# EAGLE design KRC_FOC_v2_6 (EAGLE 9.7.0)
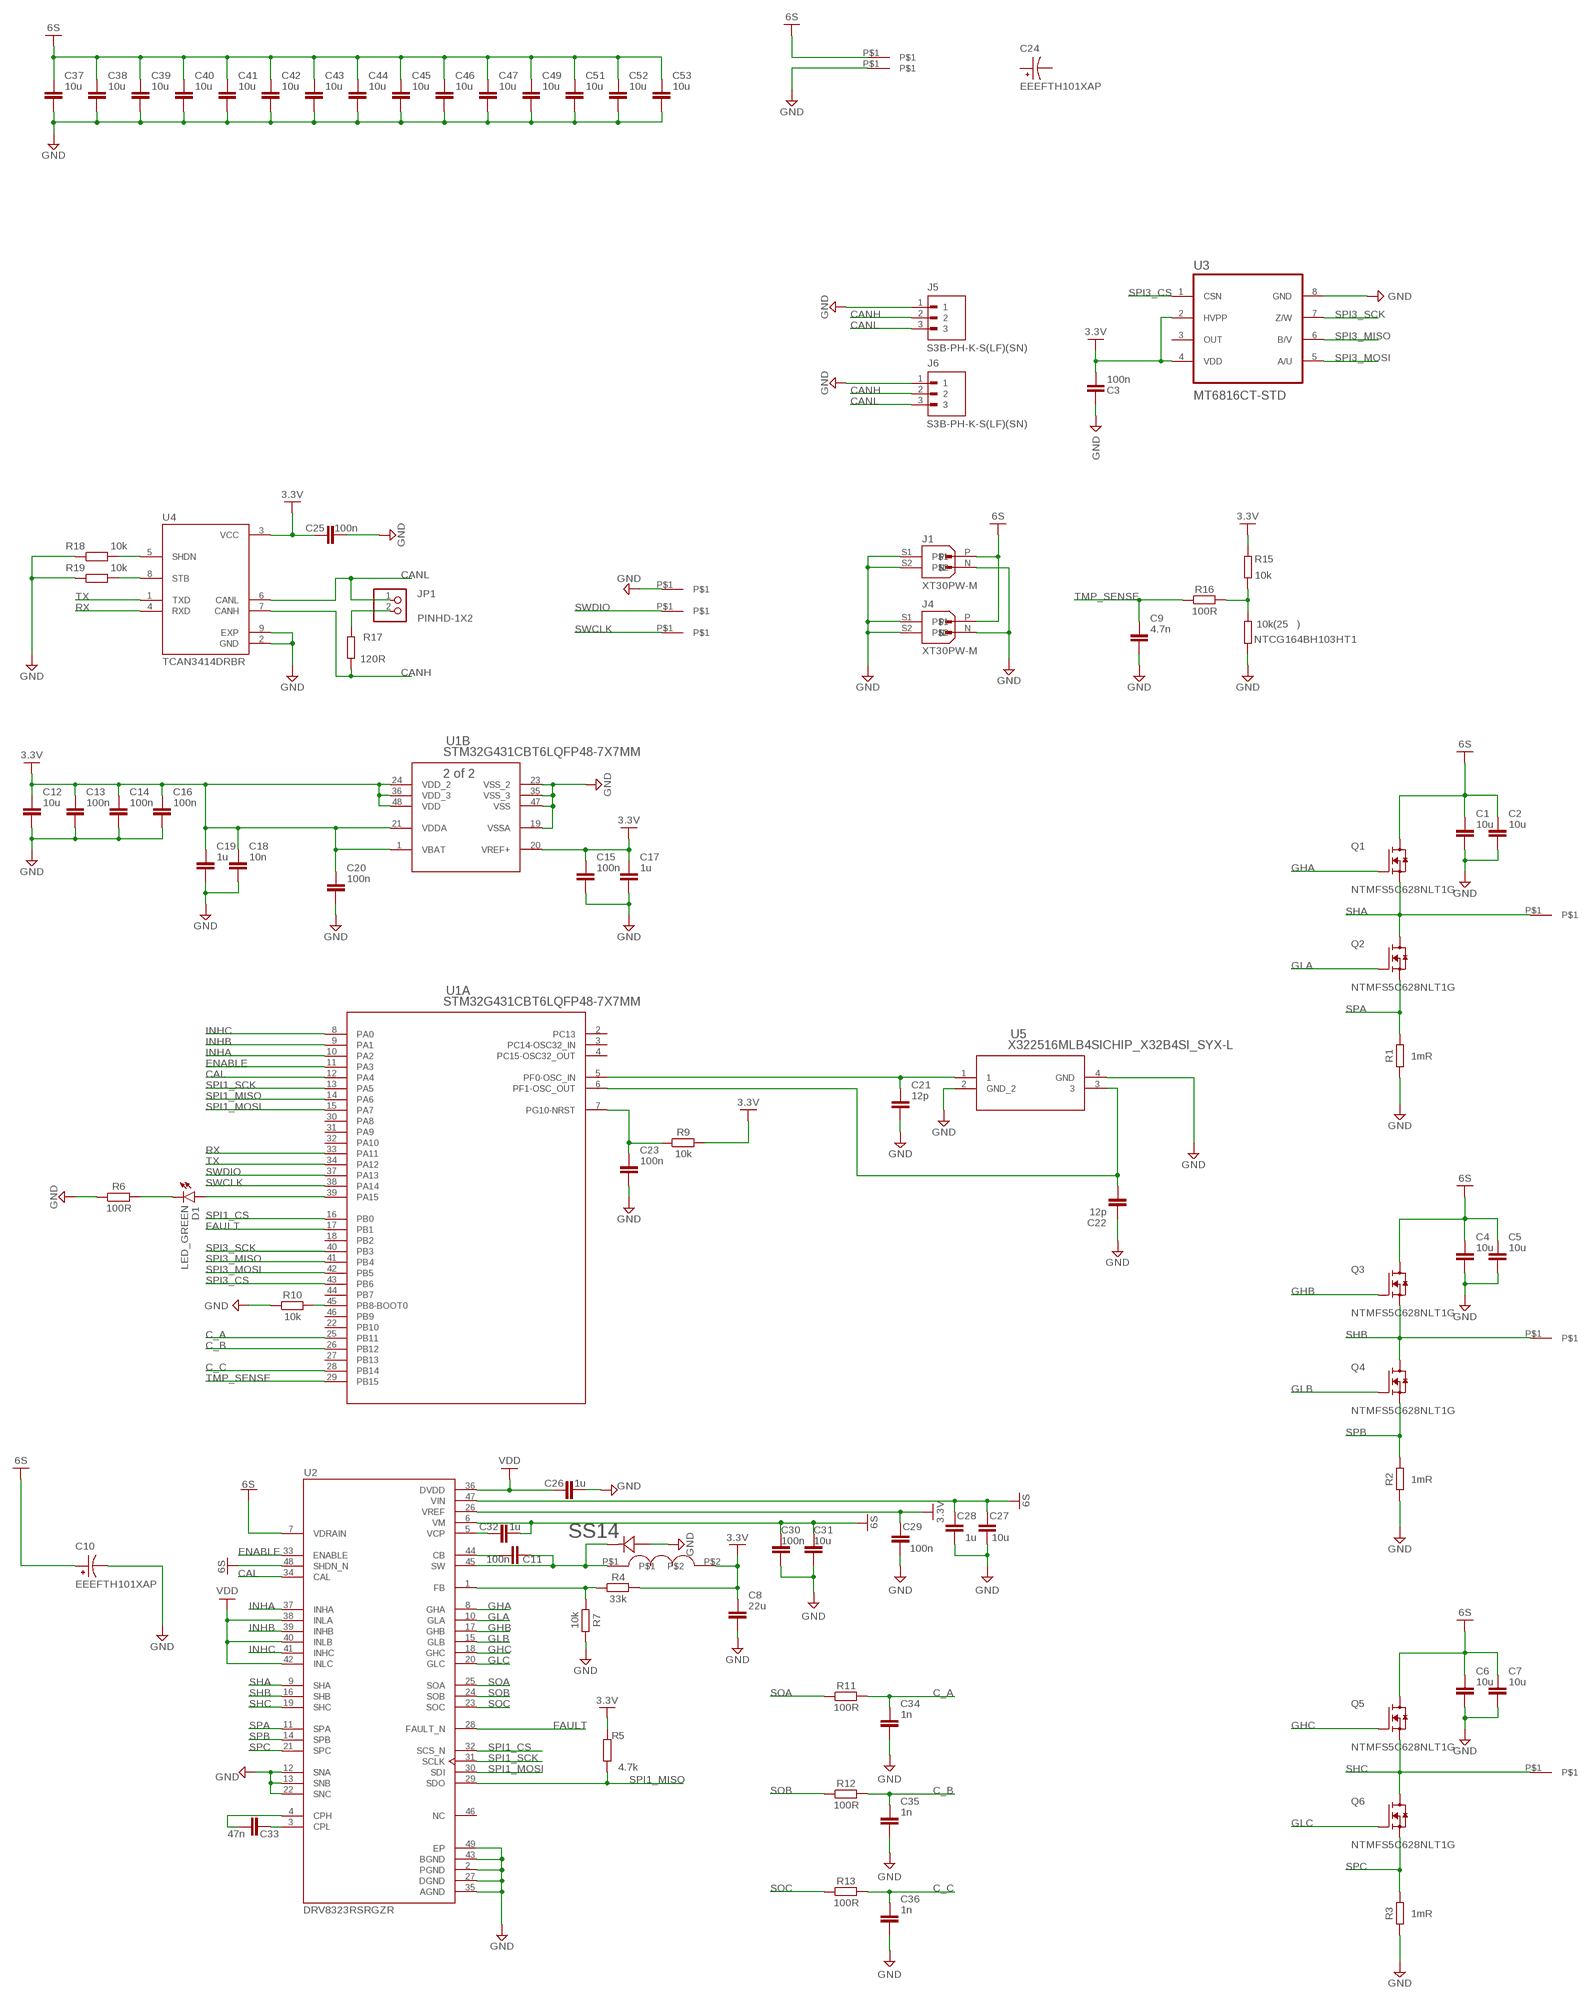
[diagram p0: schematic, sheet 1]

## Parts
C1  10u  C_CHIP-1206(3216-METRIC)  [CAPC3216X135]
C2  10u  C_CHIP-1206(3216-METRIC)  [CAPC3216X135]
C3  100n  C_CHIP-0402(1005-METRIC)  [CAPC1005X60]
C4  10u  C_CHIP-1206(3216-METRIC)  [CAPC3216X135]
C5  10u  C_CHIP-1206(3216-METRIC)  [CAPC3216X135]
C6  10u  C_CHIP-1206(3216-METRIC)  [CAPC3216X135]
C7  10u  C_CHIP-1206(3216-METRIC)  [CAPC3216X135]
C8  22u  C_CHIP-0805(2012-METRIC)  [CAPC2012X110]
C9  4.7n  C_CHIP-0402(1005-METRIC)  [CAPC1005X60]
C10  EEEFTH101XAP  [CAP_EEEFTH101XAP]
C11  100n  C_CHIP-0603(1608-METRIC)  [CAPC1608X85]
C12  10u  C_CHIP-1206(3216-METRIC)  [CAPC3216X135]
C13  100n  C_CHIP-0402(1005-METRIC)  [CAPC1005X60]
C14  100n  C_CHIP-0402(1005-METRIC)  [CAPC1005X60]
C15  100n  C_CHIP-0402(1005-METRIC)  [CAPC1005X60]
C16  100n  C_CHIP-0402(1005-METRIC)  [CAPC1005X60]
C17  1u  C_CHIP-0402(1005-METRIC)  [CAPC1005X60]
C18  10n  C_CHIP-0402(1005-METRIC)  [CAPC1005X60]
C19  1u  C_CHIP-0402(1005-METRIC)  [CAPC1005X60]
C20  100n  C_CHIP-0402(1005-METRIC)  [CAPC1005X60]
C21  12p  C_CHIP-0402(1005-METRIC)  [CAPC1005X60]
C22  12p  C_CHIP-0402(1005-METRIC)  [CAPC1005X60]
C23  100n  C_CHIP-0402(1005-METRIC)  [CAPC1005X60]
C24  EEEFTH101XAP  [CAP_EEEFTH101XAP]
C25  100n  C_CHIP-0402(1005-METRIC)  [CAPC1005X60]
C26  1u  C_CHIP-0402(1005-METRIC)  [CAPC1005X60]
C27  10u  C_CHIP-1206(3216-METRIC)  [CAPC3216X135]
C28  1u  C_CHIP-0603(1608-METRIC)  [CAPC1608X85]
C29  100n  C_CHIP-0402(1005-METRIC)  [CAPC1005X60]
C30  100n  C_CHIP-0603(1608-METRIC)  [CAPC1608X85]
C31  10u  C_CHIP-1206(3216-METRIC)  [CAPC3216X135]
C32  1u  C_CHIP-0603(1608-METRIC)  [CAPC1608X85]
C33  47n  C_CHIP-0603(1608-METRIC)  [CAPC1608X85]
C34  1n  C_CHIP-0402(1005-METRIC)  [CAPC1005X60]
C35  1n  C_CHIP-0402(1005-METRIC)  [CAPC1005X60]
C36  1n  C_CHIP-0402(1005-METRIC)  [CAPC1005X60]
C37  10u  C_CHIP-1206(3216-METRIC)  [CAPC3216X135]
C38  10u  C_CHIP-1206(3216-METRIC)  [CAPC3216X135]
C39  10u  C_CHIP-1206(3216-METRIC)  [CAPC3216X135]
C40  10u  C_CHIP-1206(3216-METRIC)  [CAPC3216X135]
C41  10u  C_CHIP-1206(3216-METRIC)  [CAPC3216X135]
C42  10u  C_CHIP-1206(3216-METRIC)  [CAPC3216X135]
C43  10u  C_CHIP-1206(3216-METRIC)  [CAPC3216X135]
C44  10u  C_CHIP-1206(3216-METRIC)  [CAPC3216X135]
C45  10u  C_CHIP-1206(3216-METRIC)  [CAPC3216X135]
C46  10u  C_CHIP-1206(3216-METRIC)  [CAPC3216X135]
C47  10u  C_CHIP-1206(3216-METRIC)  [CAPC3216X135]
C49  10u  C_CHIP-1206(3216-METRIC)  [CAPC3216X135]
C51  10u  C_CHIP-1206(3216-METRIC)  [CAPC3216X135]
C52  10u  C_CHIP-1206(3216-METRIC)  [CAPC3216X135]
C53  10u  C_CHIP-1206(3216-METRIC)  [CAPC3216X135]
D1  LED_GREEN  LED_CHIP_GREEN-1608  [LEDC1608X39N_G]
J1  XT30PW-M  [AMASS_XT30PW-M]
J4  XT30PW-M  [AMASS_XT30PW-M]
J5  S3B-PH-K-S(LF)(SN)  [JST_S3B-PH-K-S(LF)(SN)]
J6  S3B-PH-K-S(LF)(SN)  [JST_S3B-PH-K-S(LF)(SN)]
JP1  PINHD-1X2  [1X02]
NTCG164BH103HT1  10k(25℃)  R_CHIP-0603(1608-METRIC)  [RESC1608X60]
Q1  NTMFS5C628NLT1G  [TRANS_NTMFS5C628NLT1G]
Q2  NTMFS5C628NLT1G  [TRANS_NTMFS5C628NLT1G]
Q3  NTMFS5C628NLT1G  [TRANS_NTMFS5C628NLT1G]
Q4  NTMFS5C628NLT1G  [TRANS_NTMFS5C628NLT1G]
Q5  NTMFS5C628NLT1G  [TRANS_NTMFS5C628NLT1G]
Q6  NTMFS5C628NLT1G  [TRANS_NTMFS5C628NLT1G]
R1  1mR  R_CHIP-1206(3216-METRIC)  [RESC3216X70]
R2  1mR  R_CHIP-1206(3216-METRIC)  [RESC3216X70]
R3  1mR  R_CHIP-1206(3216-METRIC)  [RESC3216X70]
R4  33k  R_CHIP-0402(1005-METRIC)  [RESC1005X40]
R5  4.7k  R_CHIP-0402(1005-METRIC)  [RESC1005X40]
R6  100R  R_CHIP-0402(1005-METRIC)  [RESC1005X40]
R7  10k  R_CHIP-0402(1005-METRIC)  [RESC1005X40]
R9  10k  R_CHIP-0402(1005-METRIC)  [RESC1005X40]
R10  10k  R_CHIP-0402(1005-METRIC)  [RESC1005X40]
R11  100R  R_CHIP-0402(1005-METRIC)  [RESC1005X40]
R12  100R  R_CHIP-0402(1005-METRIC)  [RESC1005X40]
R13  100R  R_CHIP-0402(1005-METRIC)  [RESC1005X40]
R15  10k  R_CHIP-0402(1005-METRIC)  [RESC1005X40]
R16  100R  R_CHIP-0402(1005-METRIC)  [RESC1005X40]
R17  120R  R_CHIP-0805(2012-METRIC)  [RESC2012X65]
R18  10k  R_CHIP-0402(1005-METRIC)  [RESC1005X40]
R19  10k  R_CHIP-0402(1005-METRIC)  [RESC1005X40]
SS14  SS14CR_SMA_403AE_OSI-L  [CR_SMA_403AE_OSI-L]
U1  STM32G431CBT6LQFP48-7X7MM  [LQFP48-7X7MM]
U2  DRV8323RSRGZR  [QFN50P700X700X100-49N]
U3  MT6816CT-STD  [SOIC127P599X175-8N]
U4  TCAN3414DRBR  [XCVR_TCAN3414DRBR]
U5  X322516MLB4SICHIP_X32B4SI_SYX-L  [CHIP_X32B4SI_SYX-L]
U$1  PAD_1_1.5  [PAD_1_1.5]
U$2  PAD_1_1.5  [PAD_1_1.5]
U$3  YNR4030-220M  [YNR4030-220M]
U$4  PAD_1_1.5  [PAD_1_1.5]
U$5  PAD_1_1.5  [PAD_1_1.5]
U$8  PAD_1_1.5  [PAD_1_1.5]
U$9  1.5MM1.5MM  [1.5MM]
U$10  1.5MM1.5MM  [1.5MM]
U$11  1.5MM1.5MM  [1.5MM]

## Nets
3.3V: C3.2 C8.1 C12.1 C13.1 C14.1 C15.1 C16.1 C17.1 C18.1 C19.1 C20.1 C25.1 C29.1 R4.2 R5.2 R9.2 R15.2 U1.1(B:VBAT) U1.20(B:VREF+) U1.21(B:VDDA) U1.24(B:VDD_2) U1.36(B:VDD_3) U1.48(B:VDD) U2.26(VREF) U3.2(HVPP) U3.4(VDD) U4.3(VCC) U$3.P$2
6S: C1.1 C2.1 C4.1 C5.1 C6.1 C7.1 C10.1 C27.1 C28.1 C30.2 C31.2 C32.2 C37.1 C38.1 C39.1 C40.1 C41.1 C42.1 C43.1 C44.1 C45.1 C46.1 C47.1 C49.1 C51.1 C52.1 C53.1 J1.P J4.P Q1.5(D) Q3.5(D) Q5.5(D) U2.6(VM) U2.7(VDRAIN) U2.47(VIN) U2.48(SHDN_N) U$5.P$1
C_A: C34.1 R11.2 U1.25(A:PB11)
C_B: C35.1 R12.2 U1.26(A:PB12)
C_C: C36.1 R13.2 U1.28(A:PB14)
CAL: U1.12(A:PA4) U2.34(CAL)
CANH: J5.2 J6.2 R17.1 U4.7(CANH)
CANL: J5.3 J6.3 JP1.1 U4.6(CANL)
ENABLE: U1.11(A:PA3) U2.33(ENABLE)
FAULT: U1.17(A:PB1) U2.28(FAULT_N)
GHA: Q1.4(G) U2.8(GHA)
GHB: Q3.4(G) U2.17(GHB)
GHC: Q5.4(G) U2.18(GHC)
GLA: Q2.4(G) U2.10(GLA)
GLB: Q4.4(G) U2.15(GLB)
GLC: Q6.4(G) U2.20(GLC)
GND: C1.2 C2.2 C3.1 C4.2 C5.2 C6.2 C7.2 C8.2 C9.2 C10.2 C12.2 C13.2 C14.2 C15.2 C16.2 C17.2 C18.2 C19.2 C20.2 C21.2 C22.1 C23.2 C25.2 C26.2 C27.2 C28.2 C29.2 C30.1 C31.1 C34.2 C35.2 C36.2 C37.2 C38.2 C39.2 C40.2 C41.2 C42.2 C43.2 C44.2 C45.2 C46.2 C47.2 C49.2 C51.2 C52.2 C53.2 J1.N J1.S1 J1.S2 J4.N J4.S1 J4.S2 J5.1 J6.1 NTCG164BH103HT1.1 R1.1 R2.1 R3.1 R6.1 R7.2 R10.1 R18.1 R19.1 SS14.2(ANODE) U1.19(B:VSSA) U1.23(B:VSS_2) U1.35(B:VSS_3) U1.47(B:VSS) U2.2(PGND) U2.12(SNA) U2.13(SNB) U2.22(SNC) U2.27(DGND) U2.35(AGND) U2.43(BGND) U2.49(EP) U3.8(GND) U4.2(GND) U4.9(EXP) U5.2(GND_2) U5.4(GND) U$1.P$1 U$2.P$1
INHA: U1.10(A:PA2) U2.37(INHA)
INHB: U1.9(A:PA1) U2.39(INHB)
INHC: U1.8(A:PA0) U2.41(INHC)
N$1: C21.1 U1.5(A:PF0-OSC_IN) U5.1
N$2: C11.1 SS14.1(CATHODE) U2.45(SW) U$3.P$1
N$3: C11.2 U2.44(CB)
N$4: R4.1 R7.1 U2.1(FB)
N$5: C32.1 U2.5(VCP)
N$6: C33.1 U2.3(CPL)
N$7: C33.2 U2.4(CPH)
N$8: C22.2 U1.6(A:PF1-OSC_OUT) U5.3
N$9: D1.1(C) R6.2
N$10: C23.1 R9.1 U1.7(A:PG10-NRST)
N$11: R10.2 U1.45(A:PB8-BOOT0)
N$12: NTCG164BH103HT1.2 R15.1 R16.2
N$13: JP1.2 R17.2
N$14: R18.2 U4.5(SHDN)
N$15: R19.2 U4.8(STB)
N$16: D1.2(A) U1.39(A:PA15)
RX: U1.33(A:PA11) U4.4(RXD)
SHA: Q1.1(S) Q1.2(S) Q1.3(S) Q2.5(D) U2.9(SHA) U$9.P$1
SHB: Q3.1(S) Q3.2(S) Q3.3(S) Q4.5(D) U2.16(SHB) U$10.P$1
SHC: Q5.1(S) Q5.2(S) Q5.3(S) Q6.5(D) U2.19(SHC) U$11.P$1
SOA: R11.1 U2.25(SOA)
SOB: R12.1 U2.24(SOB)
SOC: R13.1 U2.23(SOC)
SPA: Q2.1(S) Q2.2(S) Q2.3(S) R1.2 U2.11(SPA)
SPB: Q4.1(S) Q4.2(S) Q4.3(S) R2.2 U2.14(SPB)
SPC: Q6.1(S) Q6.2(S) Q6.3(S) R3.2 U2.21(SPC)
SPI1_CS: U1.16(A:PB0) U2.32(SCS_N)
SPI1_MISO: R5.1 U1.14(A:PA6) U2.29(SDO)
SPI1_MOSI: U1.15(A:PA7) U2.30(SDI)
SPI1_SCK: U1.13(A:PA5) U2.31(SCLK)
SPI3_CS: U1.43(A:PB6) U3.1(CSN)
SPI3_MISO: U1.41(A:PB4) U3.6(B/V)
SPI3_MOSI: U1.42(A:PB5) U3.5(A/U)
SPI3_SCK: U1.40(A:PB3) U3.7(Z/W)
SWCLK: U1.38(A:PA14) U$8.P$1
SWDIO: U1.37(A:PA13) U$4.P$1
TMP_SENSE: C9.1 R16.1 U1.29(A:PB15)
TX: U1.34(A:PA12) U4.1(TXD)
VDD: C26.1 U2.36(DVDD) U2.38(INLA) U2.40(INLB) U2.42(INLC)
Unconnected: C24.1 C24.2 U1.2(A:PC13) U1.3(A:PC14-OSC32_IN) U1.4(A:PC15-OSC32_OUT) U1.18(A:PB2) U1.22(A:PB10) U1.27(A:PB13) U1.30(A:PA8) U1.31(A:PA9) U1.32(A:PA10) U1.44(A:PB7) U1.46(A:PB9) U2.46(NC) U3.3(OUT)

## Library data of the parts
C1 C2 C4-C7 C12 C27 C31 C37-C47 C49 C51-C53 = Capacitor:C: Capacitor - Generic; LCSC: C13585
C3 C13-C16 C20 C23 C25 C29 = Capacitor:C: Capacitor - Generic; LCSC: C1525
C8 = Capacitor:C: Capacitor - Generic; LCSC: C45783
C9 = Capacitor:C: Capacitor - Generic; LCSC: C1538
C10 C24 = EEEFTH101XAP:EEEFTH101XAP: Check availability <https://pricing.snapeda.com/parts/EEE-FTH101XAP/Panasonic%20Electronic/view-part?ref=eda>; LCSC: C165974
C11 = Tutorial - Fusion 360:C: Capacitor - Generic; LCSC: C14663
C17 C19 C26 = Capacitor:C: Capacitor - Generic; LCSC: C52923
C18 = Capacitor:C: Capacitor - Generic; LCSC: C15195
C21 C22 = Capacitor:C: Capacitor - Generic; LCSC: C1547
C28 C32 = Capacitor:C: Capacitor - Generic; LCSC: C15849
C30 = Capacitor:C: Capacitor - Generic; LCSC: C14663
C33 = Capacitor:C: Capacitor - Generic; LCSC: C1622
C34-C36 = Capacitor:C: Capacitor - Generic; LCSC: C1523
D1 = Opto-Electronic:LED_CHIP: LED - Generic; LCSC: C12624
J1 J4 = XT30PW-M:XT30PW-M: Check availability <https://pricing.snapeda.com/parts/XT30PW-M/AMASS/view-part?ref=eda>
J5 J6 = S3B-PH-K-S_LF__SN_:S3B-PH-K-S(LF)(SN): Check availability <https://pricing.snapeda.com/parts/S3B-PH-K-S%28LF%29%28SN%29/JST%20Sales/view-part?ref=eda>
JP1 = Connector:PINHD-1X2: PIN HEADER
NTCG164BH103HT1 = Resistor:R: Resistor Fixed - Generic; LCSC: C415353
Q1-Q6 = NTMFS5C628NLT1G:NTMFS5C628NLT1G: Check availability <https://pricing.snapeda.com/parts/NTMFS5C628NLT1G/onsemi/view-part?ref=eda>; LCSC: C145537
R1-R3 = Resistor:R: Resistor Fixed - Generic; LCSC: C393098
R4 = Resistor:R: Resistor Fixed - Generic; LCSC: C25779
R5 = Resistor:R: Resistor Fixed - Generic; LCSC: C25900
R6 R11-R13 R16 = Resistor:R: Resistor Fixed - Generic; LCSC: C25076
R7 R9 R10 R15 R18 R19 = Resistor:R: Resistor Fixed - Generic; LCSC: C25744
R17 = Resistor:R: Resistor Fixed - Generic; LCSC: C17437
SS14 = SS14:SS14; LCSC: C2480
U1 = STM32G431CBT6:STM32G431CBT6; LCSC: C529355
U2 = DRV8323RSRGZR:DRV8323RSRGZR; LCSC: C545497
U3 = MT6816CT-STD:MT6816CT-STD: Check availability <https://pricing.snapeda.com/parts/LM358DR/Rohm%20Semiconductor/view-part?ref=eda>; LCSC: C2991083
U4 = TCAN3414DRBR:TCAN3414DRBR: Check availability <https://pricing.snapeda.com/parts/TCAN3414DRBR/Texas%20Instruments/view-part?ref=eda>; LCSC: C31542495
U5 = X322516MLB4SI:X322516MLB4SI; LCSC: C13738
U$1 U$2 U$4 U$5 U$8 = pad_1_1.5:PAD_1_1.5
U$3 = YNR4030-220M:YNR4030-220M; LCSC: C341013
U$9-U$11 = 1.5mm:1.5MM

## Board
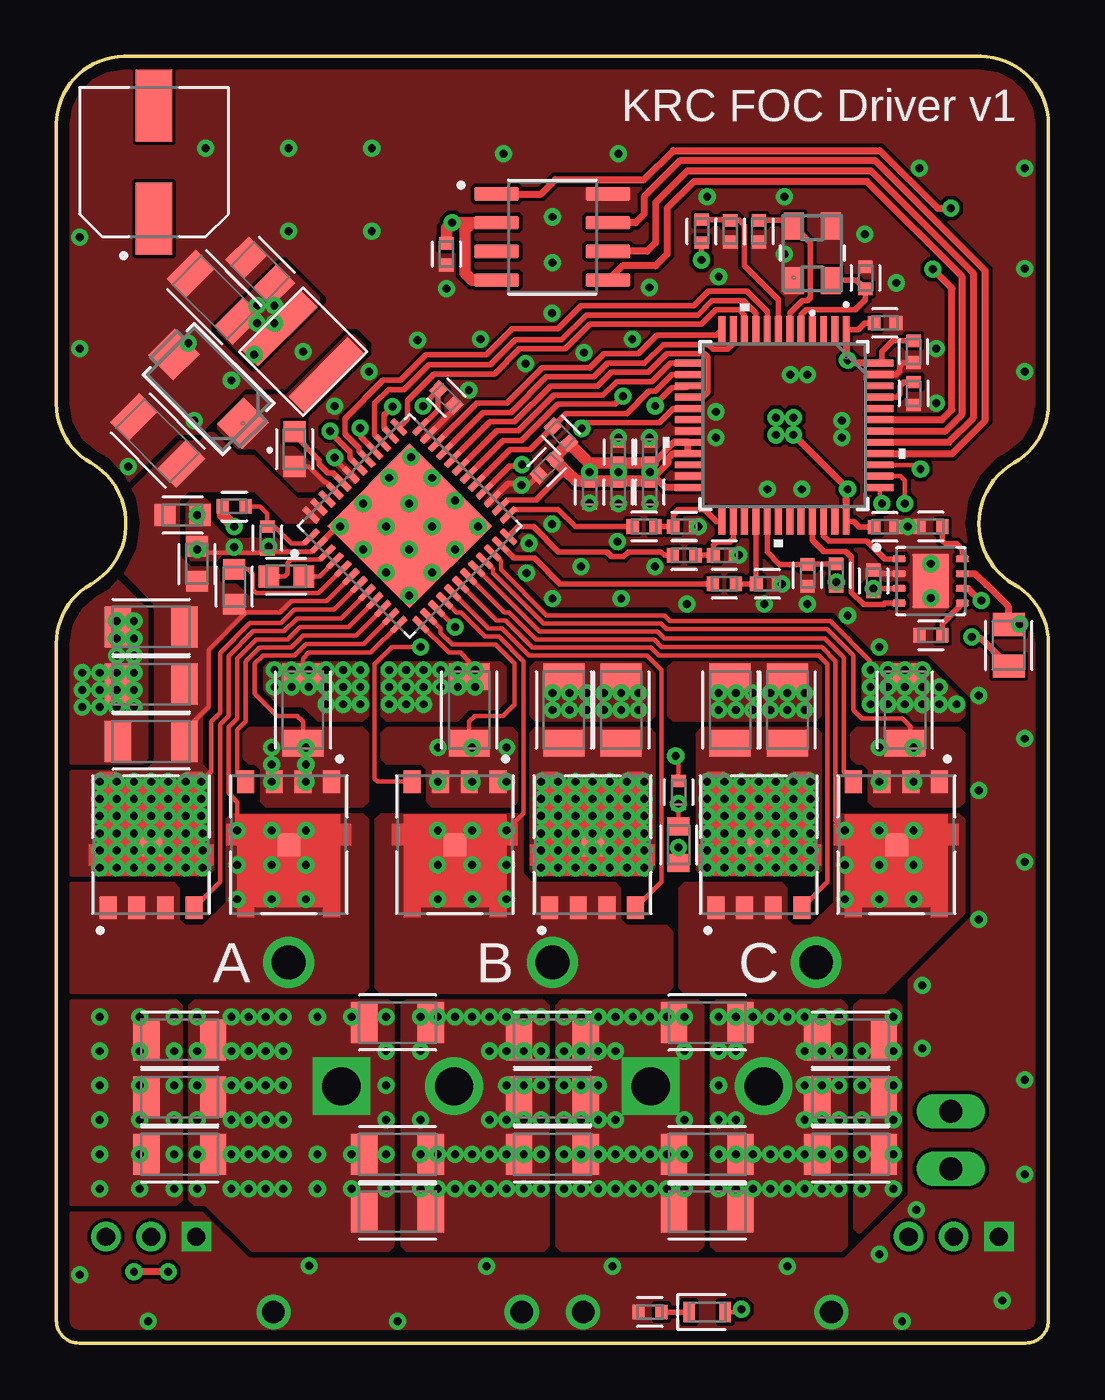
[diagram p1: board, top side]
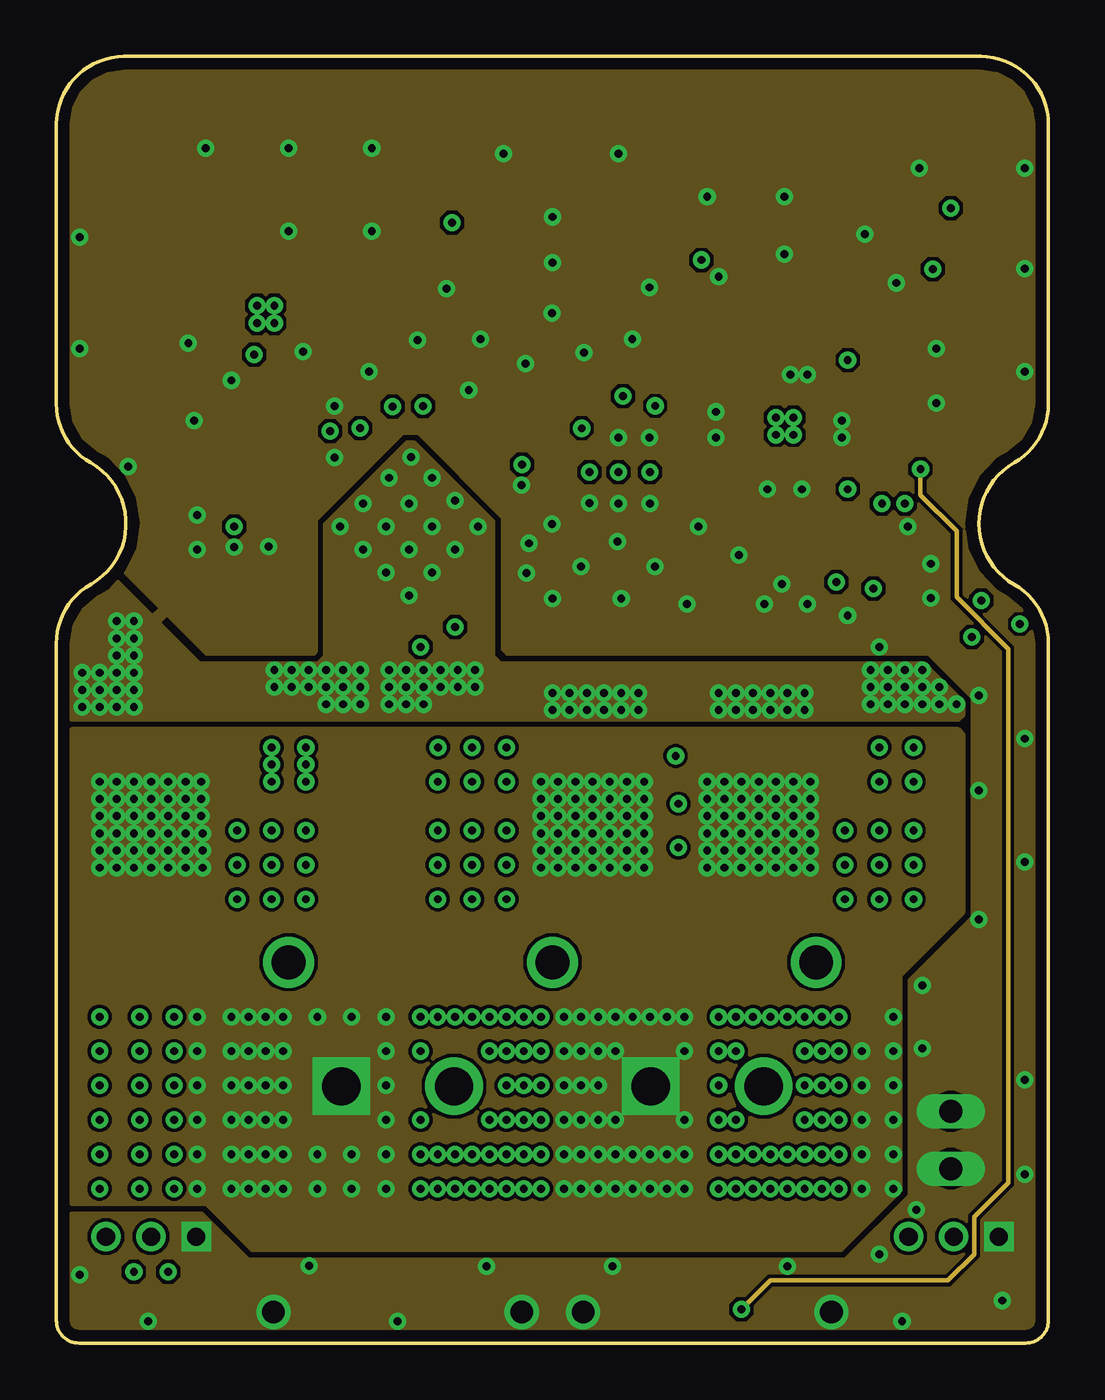
[diagram p2: board, inner layer Route2]
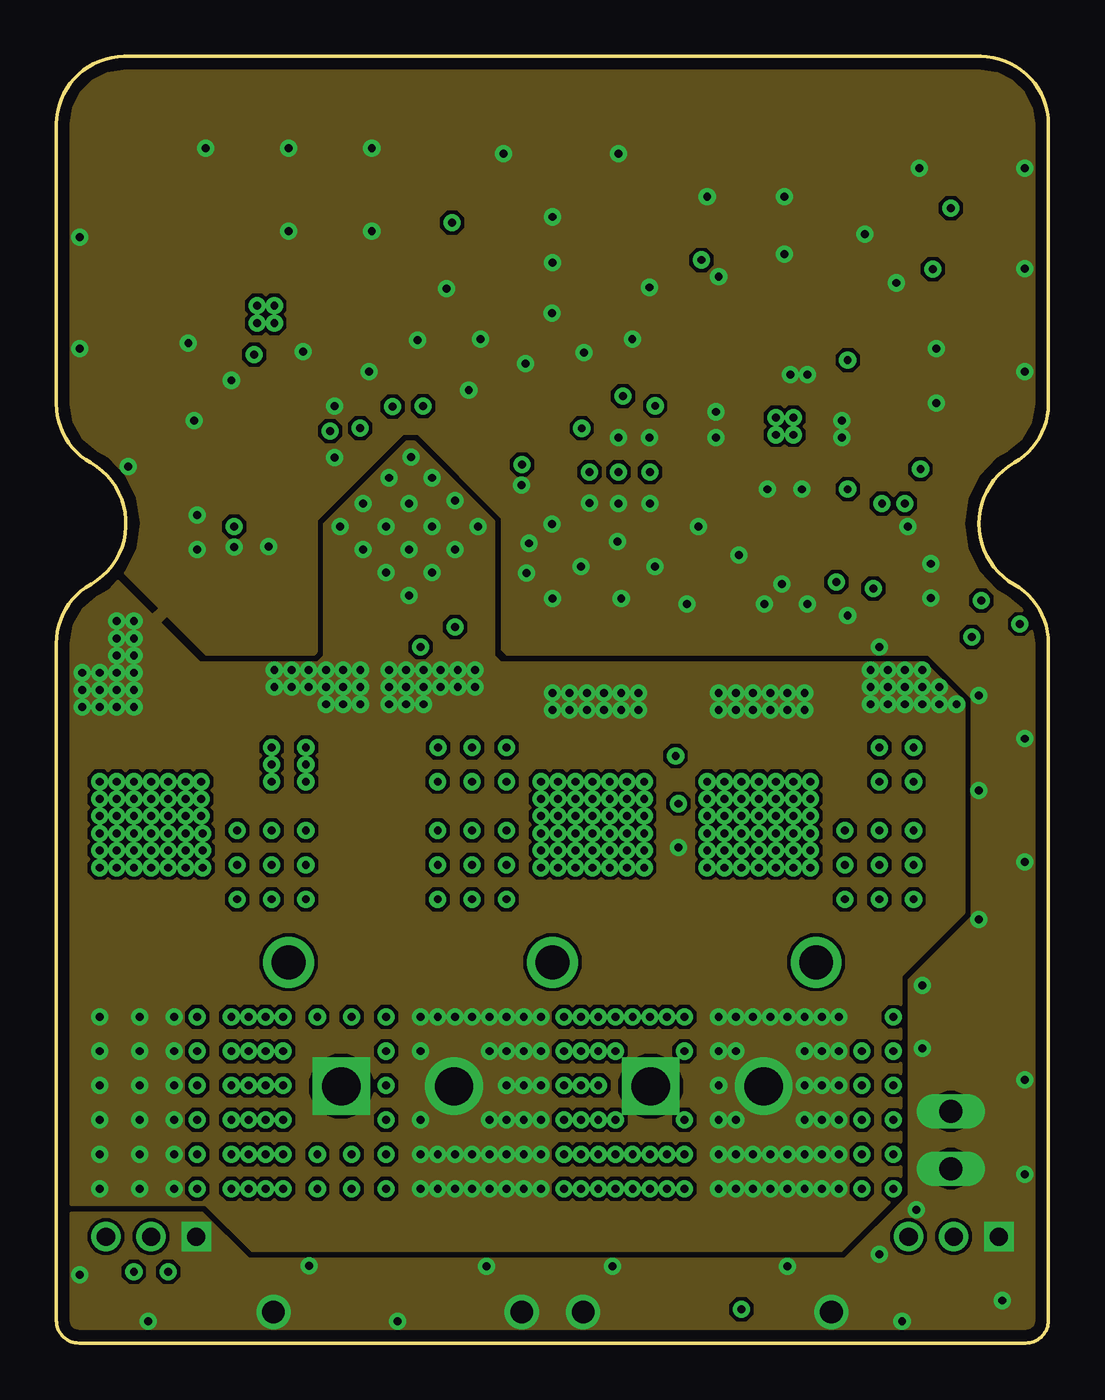
[diagram p3: board, inner layer Route3]
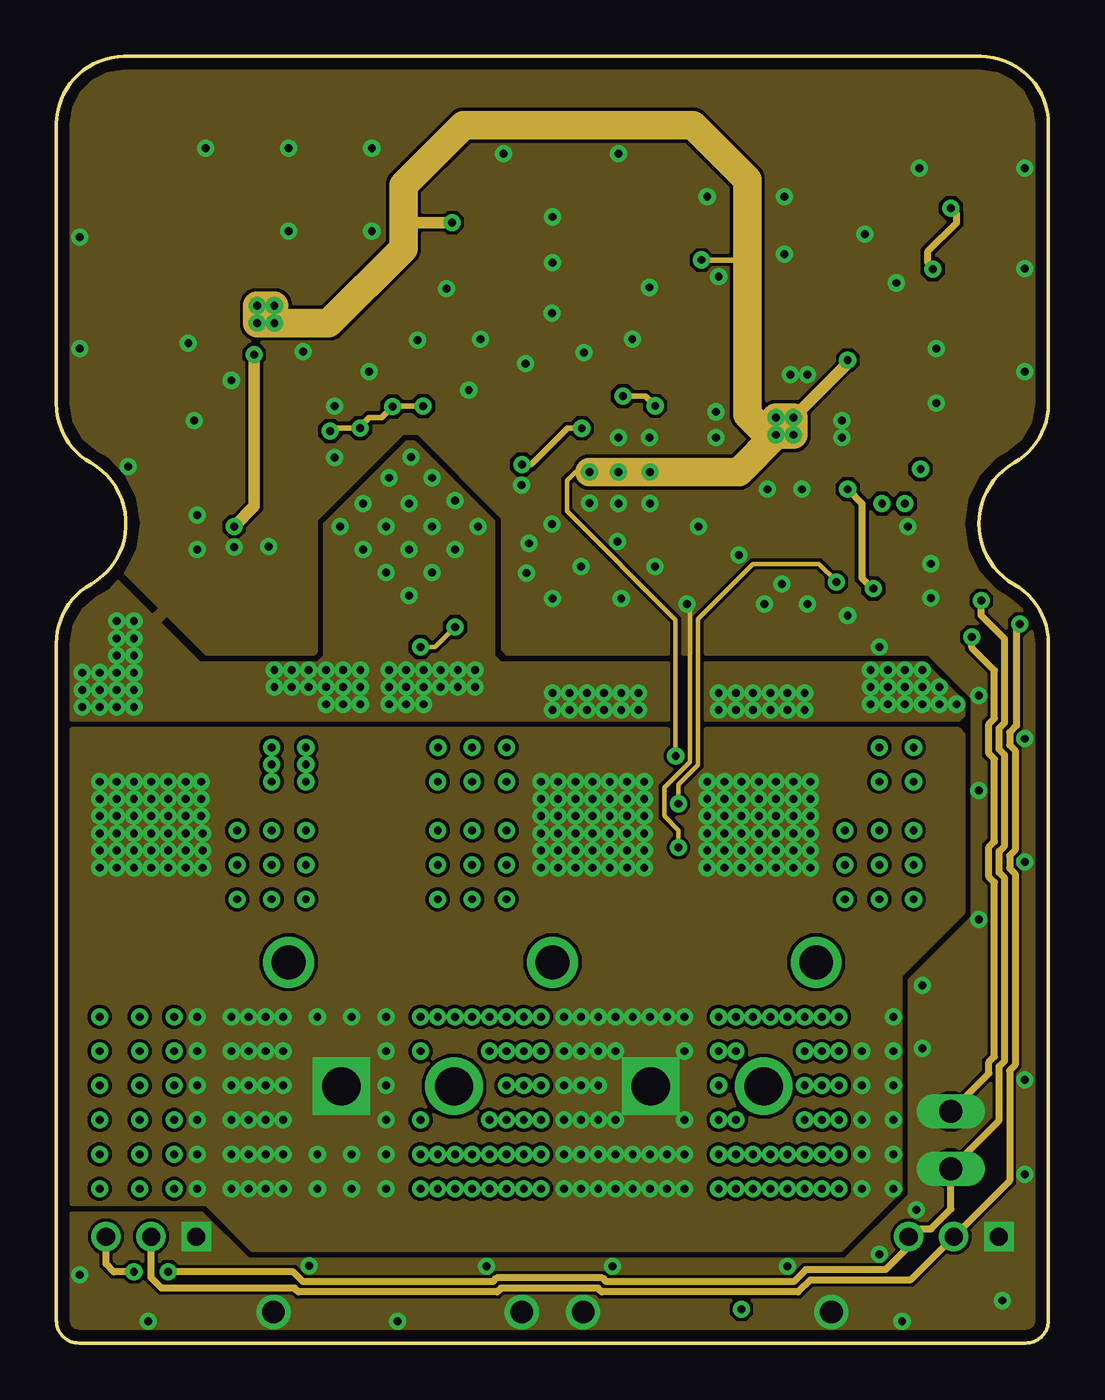
[diagram p4: board, inner layer Route62]
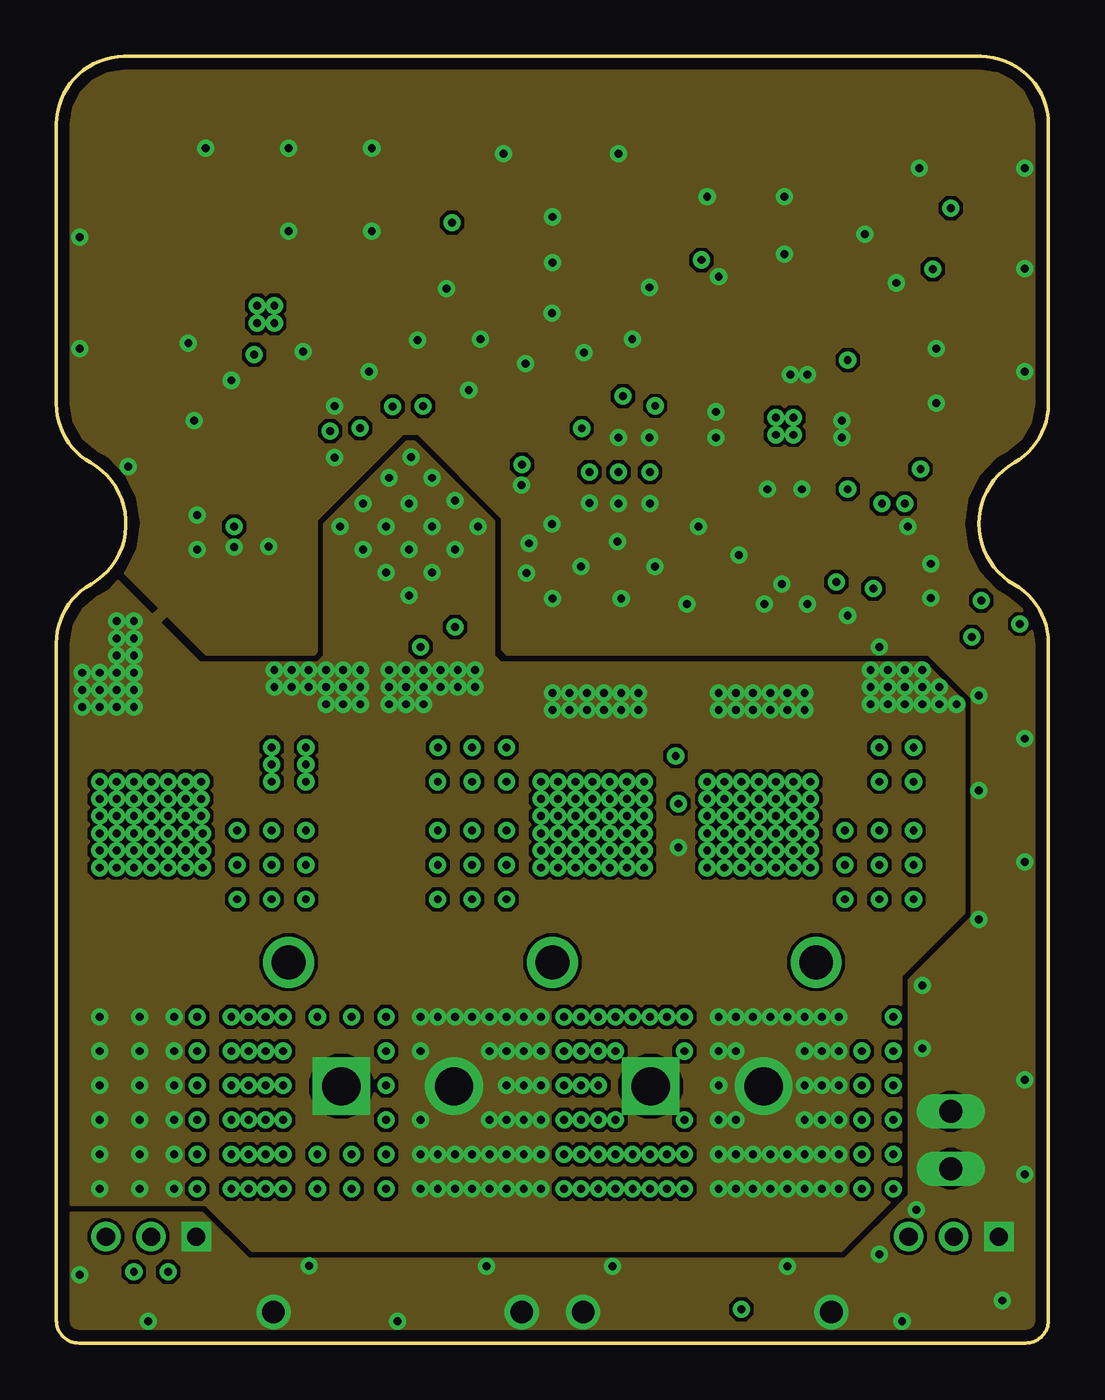
[diagram p5: board, inner layer Route63]
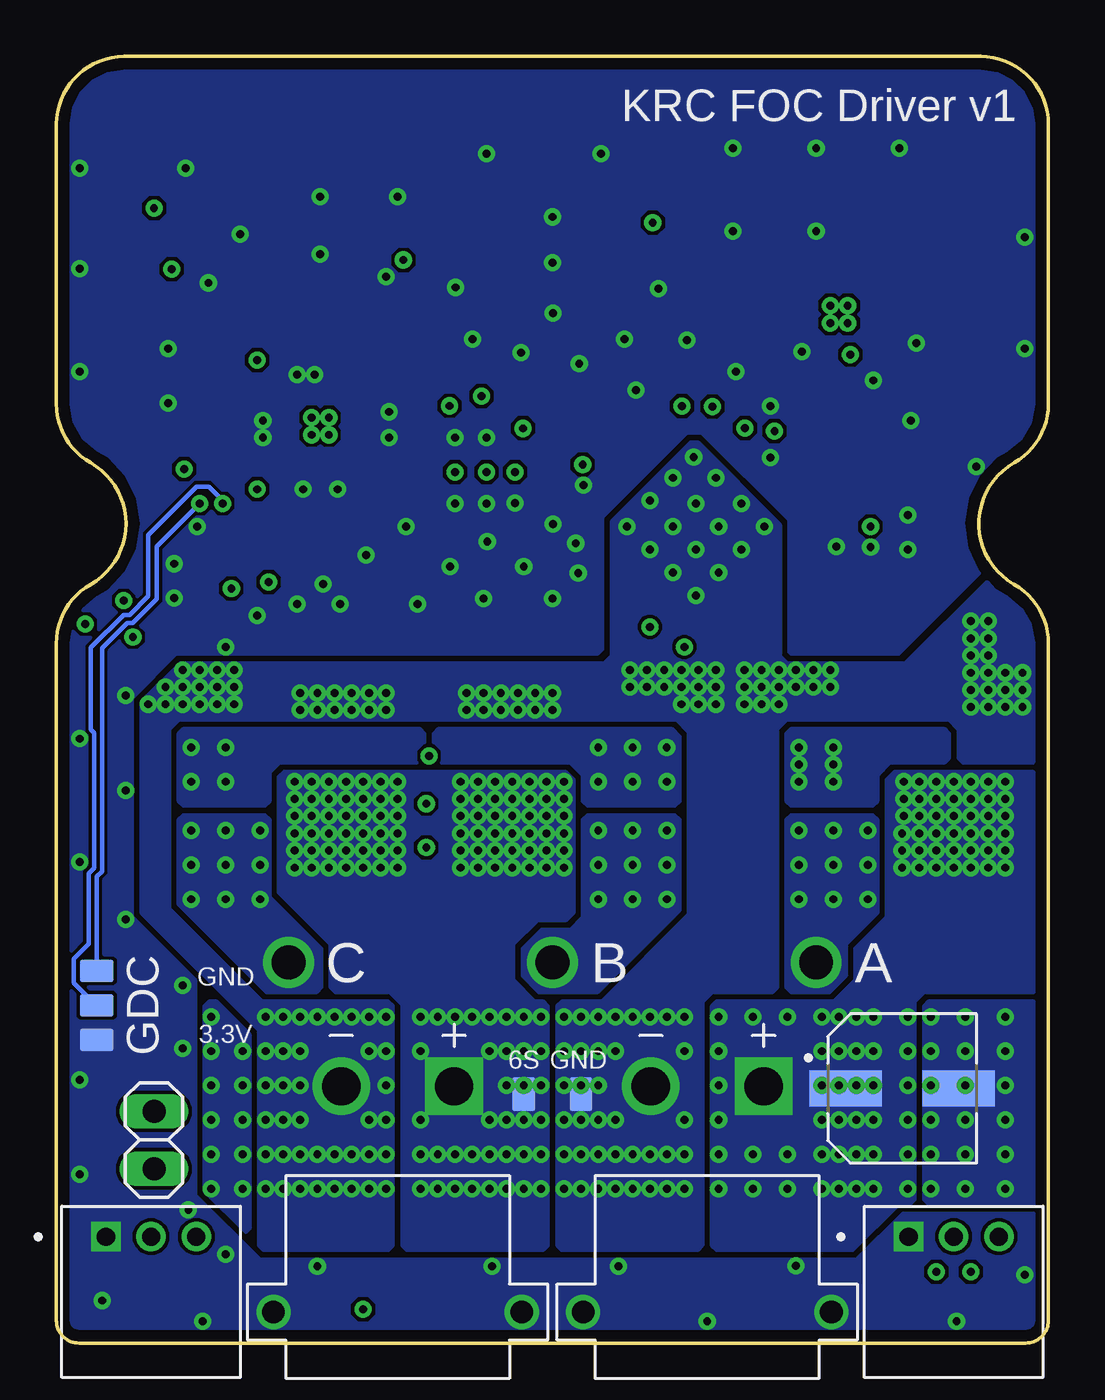
[diagram p6: board, bottom side, seen from below]

Size 43.95 x 57 mm. Coordinates in mm from the lower left corner, seen from the top.
Outline: 1.52,33.61 arc60 0,31 0,1 arc90 1,0 42.95,0 arc90 43.95,1 43.95,31 arc60 42.43,33.61 arc-121 42.43,39 arc60 43.95,41.6 43.95,54 arc90 40.95,57 3,57 arc90 0,54 0,41.6 arc60 1.52,39 arc-120 1.55,33.63 arc-1 1.52,33.61
Copper layers (1+2*3+14*15+16): Top / Route2 / Route3 / Route62 / Route63 / Bottom
Stack-up 6 Layer Stack: Top SilkScreen Epoxy Ink / Top SolderMask SR:Green 0.0254mm Dk 4.3 / Top Surface Finish Lead-Free 0.02mm / Top CuFoil:007 0.035mm / Dielectric-1 Prepreg:001 0.064mm / Dielectric-2 Prepreg:001 0.064mm / Route2 CuFoil:007 0.035mm / Dielectric-3 Core:077 0.457mm / Route3 CuFoil:007 0.035mm / Dielectric-4 Prepreg:001 0.064mm / Dielectric-5 Prepreg:001 0.064mm / Route62 CuFoil:007 0.035mm / Dielectric-6 Core:077 0.457mm / Route63 CuFoil:007 0.035mm / Dielectric-7 Prepreg:001 0.064mm / Dielectric-8 Prepreg:001 0.064mm / Bottom CuFoil:007 0.035mm / Bottom Surface Finish Lead-Free 0.02mm / Bottom SolderMask SR:Green 0.0254mm Dk 4.3 / Bottom SilkScreen Epoxy Ink
Design rules: minimum copper width 6mil, minimum drill size 0.35mm, copper clearance wire_polygon to wire_polygon 6mil, copper clearance wire_polygon to pad_smd 6mil, copper clearance wire_polygon to via 6mil, copper clearance pad_smd to pad_smd 6mil, copper clearance pad_smd to via 6mil, copper clearance via to via 6mil, copper clearance smd to pad (same net) 6mil, copper clearance smd to via (same net) 6mil, copper clearance smd to smd (same net) 6mil, dimension clearance 20mil, via restrict clearance 0mil, restrict clearance 0mil, drill distance 6mil, keepout clearance 0mil

### Footprints (pad centres in the part's own frame; a part is rotated, then mirrored left to right if it is on the bottom)
CAPC3216X135 = smd 1.165 x 1.815: 1 -1.475,0; 2 1.475,0
CAPC1005X60 = smd 0.56 x 0.629: 1 -0.485,0; 2 0.485,0
CAPC2012X110 = smd 1.165 x 1.465: 1 -0.875,0; 2 0.875,0
CAP_EEEFTH101XAP = smd 3.2 x 1.6: 1 -2.5,0; 2 2.5,0
CAPC1608X85 = smd 0.921 x 0.97: 1 -0.775,0; 2 0.775,0
LEDC1608X39N_G = smd 0.512 x 0.912: 1 -0.8,0; 2 0.8,0
AMASS_XT30PW-M = drill 1.7: N 2.5,-10 | drill 1.7 square: P -2.5,-10 | drill 1: S1 5.5,0; S2 -5.5,0
JST_S3B-PH-K-S(LF)(SN) = drill 0.8 pad 1.2 square: 1 -2,2.45 | drill 0.8 pad 1.2: 2 0,2.45; 3 2,2.45
1X02 = drill 1.016 long: 1 -1.27,0; 2 1.27,0
RESC1608X60 = smd 0.799 x 0.974: 1 -0.815,0; 2 0.815,0
TRANS_NTMFS5C628NLT1G = smd 1 x 0.75: 1 -2.795,1.905; 2 -2.795,0.635; 3 -2.795,-0.635; 4 -2.795,-1.905 | smd 1 x 1: 5 0,0
RESC3216X70 = smd 1.165 x 1.815: 1 -1.475,0; 2 1.475,0
RESC1005X40 = smd 0.535 x 0.644: 1 -0.507,0; 2 0.507,0
RESC2012X65 = smd 1.031 x 1.42: 1 -0.919,0; 2 0.919,0
CR_SMA_403AE_OSI-L = smd 1.575 x 1.651: 1 -2.159,0; 2 2.159,0
LQFP48-7X7MM = smd 1.194 x 0.305: 1 -4.25,2.75; 2 -4.25,2.25; 3 -4.25,1.75; 4 -4.25,1.25; 5 -4.25,0.75; 6 -4.25,0.25; 7 -4.25,-0.25; 8 -4.25,-0.75; 9 -4.25,-1.25; 10 -4.25,-1.75; 11 -4.25,-2.25; 12 -4.25,-2.75; 25 4.25,-2.75; 26 4.25,-2.25; 27 4.25,-1.75; 28 4.25,-1.25; 29 4.25,-0.75; 30 4.25,-0.25; 31 4.25,0.25; 32 4.25,0.75; 33 4.25,1.25; 34 4.25,1.75; 35 4.25,2.25; 36 4.25,2.75 | smd 0.305 x 1.194: 13 -2.75,-4.25; 14 -2.25,-4.25; 15 -1.75,-4.25; 16 -1.25,-4.25; 17 -0.75,-4.25; 18 -0.25,-4.25; 19 0.25,-4.25; 20 0.75,-4.25; 21 1.25,-4.25; 22 1.75,-4.25; 23 2.25,-4.25; 24 2.75,-4.25; 37 2.75,4.25; 38 2.25,4.25; 39 1.75,4.25; 40 1.25,4.25; 41 0.75,4.25; 42 0.25,4.25; 43 -0.25,4.25; 44 -0.75,4.25; 45 -1.25,4.25; 46 -1.75,4.25; 47 -2.25,4.25; 48 -2.75,4.25
QFN50P700X700X100-49N = smd 0.86 x 0.26: 1 -3.435,2.75; 2 -3.435,2.25; 3 -3.435,1.75; 4 -3.435,1.25; 5 -3.435,0.75; 6 -3.435,0.25; 7 -3.435,-0.25; 8 -3.435,-0.75; 9 -3.435,-1.25; 10 -3.435,-1.75; 11 -3.435,-2.25; 12 -3.435,-2.75; 25 3.435,-2.75; 26 3.435,-2.25; 27 3.435,-1.75; 28 3.435,-1.25; 29 3.435,-0.75; 30 3.435,-0.25; 31 3.435,0.25; 32 3.435,0.75; 33 3.435,1.25; 34 3.435,1.75; 35 3.435,2.25; 36 3.435,2.75 | smd 0.26 x 0.86: 13 -2.75,-3.435; 14 -2.25,-3.435; 15 -1.75,-3.435; 16 -1.25,-3.435; 17 -0.75,-3.435; 18 -0.25,-3.435; 19 0.25,-3.435; 20 0.75,-3.435; 21 1.25,-3.435; 22 1.75,-3.435; 23 2.25,-3.435; 24 2.75,-3.435; 37 2.75,3.435; 38 2.25,3.435; 39 1.75,3.435; 40 1.25,3.435; 41 0.75,3.435; 42 0.25,3.435; 43 -0.25,3.435; 44 -0.75,3.435; 45 -1.25,3.435; 46 -1.75,3.435; 47 -2.25,3.435; 48 -2.75,3.435 | smd 5.15 x 5.15: 49 0,0
SOIC127P599X175-8N = smd 1.97 x 0.6: 1 -2.47,1.905; 2 -2.47,0.635; 3 -2.47,-0.635; 4 -2.47,-1.905; 5 2.47,-1.905; 6 2.47,-0.635; 7 2.47,0.635; 8 2.47,1.905
XCVR_TCAN3414DRBR = smd 0.6 x 0.3: 1 -1.4,0.975; 2 -1.4,0.325; 3 -1.4,-0.325; 4 -1.4,-0.975; 5 1.4,-0.975; 6 1.4,-0.325; 7 1.4,0.325; 8 1.4,0.975 | smd 1.65 x 2.4: 9 0,0
CHIP_X32B4SI_SYX-L = smd 1.194 x 0.889: 1 -1.206,-0.825; 2 1.206,-0.825; 3 1.206,0.825; 4 -1.206,0.825
PAD_1_1.5 = smd 1 x 1.5: P$1 0,0
YNR4030-220M = smd 3.7 x 1.1: P$1 0,1.5; P$2 0,-1.5
1.5MM = drill 1.5: P$1 0,0

### Placement (x,y rotation side)
C1  4.2,29.19 180 top
C2  4.2,31.73 180 top
C3  17.28,48.24 90 top
C4  25.02,28.05 90 top
C5  22.48,28.05 90 top
C6  32.39,28.05 90 top
C7  29.85,28.05 90 top
C8  9.02,47.48 135 top
C9  33.28,34.01 270 top
C10  6.48,11.28 0 bottom
C11  10.55,39.6 90 top
C12  6.99,46.33 135 top
C13  36.71,36.15 0 top
C14  37.98,43.92 270 top
C15  24.9,39.48 90 top
C16  23.63,37.7 270 top
C17  24.9,37.7 270 top
C18  26.29,39.48 90 top
C19  26.29,37.7 270 top
C20  36.71,45.19 0 top
C21  35.85,47.18 90 top
C22  31.12,49.25 90 top
C23  29.85,49.25 270 top
C24  4.32,52.32 90 top
C25  36.2,33.76 90 top
C26  17.28,41.89 315 top
C27  4.48,39.99 135 top
C28  5.59,36.68 0 top
C29  21.72,38.81 225 top
C30  6.23,34.52 270 top
C31  4.2,26.65 0 top
C32  7.88,33.51 270 top
C33  10.19,33.97 0 top
C34  27.82,36.17 0 top
C35  29.6,34.9 0 top
C36  31.5,33.63 0 top
C37  5.46,10.9 180 top
C38  15.12,8.36 0 top
C39  35.18,8.36 180 top
C40  35.18,13.44 180 top
C41  35.18,10.9 180 top
C42  5.46,13.44 180 top
C43  5.46,8.36 180 top
C44  15.12,14.2 0 top
C45  28.83,14.2 0 top
C46  28.83,5.82 0 top
C47  15.12,5.82 0 top
C49  28.83,8.36 0 top
C51  21.98,10.9 180 top
C52  21.98,8.36 180 top
C53  21.98,13.44 180 top
D1  28.83,1.38 0 top
J1  28.83,1.38 180 bottom
J4  15.12,1.38 180 bottom
J5  39.76,2.26 0 bottom
J6  4.2,2.26 0 bottom
JP1  39.63,8.99 90 bottom
NTCG164BH103HT1  27.56,22.08 90 top
Q1  4.2,22.08 90 top
Q2  10.29,22.08 270 top
Q3  23.75,22.08 90 top
Q4  17.66,22.08 270 top
Q5  31.12,22.08 90 top
Q6  37.22,22.08 270 top
R1  10.93,28.05 270 top
R2  18.29,28.05 270 top
R3  37.6,28.05 270 top
R4  7.88,37.06 180 top
R5  22.36,40.24 315 top
R6  26.29,1.38 0 top
R7  9.35,35.66 270 top
R9  28.58,49.25 270 top
R10  37.98,42.07 90 top
R11  26.04,36.17 0 top
R12  27.82,34.9 0 top
R13  29.6,33.63 0 top
R15  27.56,24.4 90 top
R16  34.55,34.01 270 top
R17  42.19,30.91 270 top
R18  38.74,31.35 0 top
R19  38.74,36.17 0 top
SS14  6.74,42.27 135 top
U1  32.24,40.65 270 top
U2  15.66,36.2 45 top
U3  21.98,49 0 top
U4  38.74,33.76 0 top
U5  33.49,48.28 90 top
U$1  20.71,11.03 180 bottom
U$2  42.17,13.44 270 bottom
U$3  10.93,43.92 225 top
U$4  42.17,14.96 270 bottom
U$5  23.25,11.03 180 bottom
U$8  42.17,16.49 270 bottom
U$9  10.29,16.87 0 top
U$10  21.98,16.87 0 top
U$11  33.66,16.87 0 top

### Tracks (layer width: path | path; a pad name or v marks a point on that pad's centre or on a via)
3.3V  (via drill 0.35)
  Top 0.203: R15.2 27.56,25.89 v27.44,26.01
  Top 0.254: U2.26 19.98,37.35 21.25,37.35 22.55,38.66 | U1.48 36.58,43.49 36.58,43.92 37.06,44.41 C14.1 | U1.1 35.53,44.91 35.82,45.19 C20.1 | U1.36 35.33,36.41 35.58,36.15 C13.1 | C25.1 v36.2,33.43 U4.3 | R9.2 v28.58,47.98 | 22.55,38.66
  Top 0.305: U1.1 34.99,43.61 v35.06,43.54 35.19,43.41 U1.48 | U1.36 34.99,37.76 v35.06,37.82 v32.64,40.24 | C18.1 26.44,38.99 27.36,39.91 U1.20 U1.21 27.31,39.41 27.09,39.18 27.09,38.98 26.5,38.38 | 26.5,38.38 C19.1 | U1.24 26.97,37.91 26.5,38.38
  Top 0.508: U3.4 18.42,47.09 18.11,47.4 18.11,49.33 18.42,49.63 U3.2 v17.53,49.63 17.28,49.38 C3.2 | C15.1 v24.9,38.59 C17.1 | 26.44,38.99 26.29,38.84 v26.29,38.59 C19.1 C17.1 | C16.1 v23.63,38.59 23.63,38.97 | C16.1 C17.1 | C18.1 C15.1 | 23.63,38.97 R5.2 22.06,39.23 C29.1 22.55,38.66 23.03,38.18 C16.1 | C15.1 23.65,38.99 23.63,38.97 | v7.88,36.18 7.37,36.69 R4.2
  Route62 0.203: v23.63,38.59 22.99,38.59 22.61,38.2 22.61,36.86 27.44,32.03 v27.44,26.01
  Route62 0.254: v28.58,47.98 30.61,47.98
  Route62 0.305: v35.06,37.82 35.69,37.19 35.69,33.89 36.14,33.43 v36.2,33.43
  Route62 0.508: v17.53,49.63 15.37,49.63 | v32.64,41 35.06,43.41 v35.06,43.54 | v8.77,43.79 8.77,37.07 v7.88,36.18
  Route62 1.27: v9.66,45.19 v9.66,45.95 v8.89,45.95 v8.89,45.19 12.07,45.19 15.37,48.49 15.37,49.63 15.37,51.29 18.04,53.95 28.2,53.95 30.61,51.54 30.61,47.98 30.61,41.13 31.5,40.24 v31.88,40.24 | v31.88,41 v32.64,41 v32.64,40.24 v31.88,40.24 | v31.88,40.24 30.23,38.59 v26.29,38.59 v24.9,38.59 v23.63,38.59
  pour Top (no thermals): 7.12,44.81 7.12,45.06 9.91,47.86 10.16,47.86 11.69,46.33 11.69,46.08 8.89,43.28 8.64,43.28
6S  (via drill 0.35)
  Top 0.203: v6.41,24.87 6.86,25.32 6.86,27.54 7.24,27.92 7.24,30.57 8.56,31.89 9.95,31.89 10.55,32.49 12.3,32.49 U2.7 | U2.6 11.97,32.87 10.42,32.87 9.91,32.36 8.39,32.36 6.74,30.71 6.74,28.17 5.67,27.11 C31.2
  other vias: 1.91,24.87 2.67,24.87 3.43,24.87 4.2,24.87 4.96,24.87 1.91,24.11 2.67,24.11 3.43,24.11 4.2,24.11 4.96,24.11 1.91,23.35 2.67,23.35 3.43,23.35 4.2,23.35 4.96,23.35 1.91,22.58 2.67,22.58 3.43,22.58 4.2,22.58 4.96,22.58 1.91,21.82 2.67,21.82 3.43,21.82 4.2,21.82 4.96,21.82 1.91,21.06 2.67,21.06 3.43,21.06 4.2,21.06 4.96,21.06 21.47,24.87 22.23,24.87 22.99,24.87 23.75,24.87 24.52,24.87 25.28,24.87 21.47,24.11 22.23,24.11 22.99,24.11 23.75,24.11 24.52,24.11 25.28,24.11 21.47,23.35 22.23,23.35 22.99,23.35 23.75,23.35 24.52,23.35 25.28,23.35 21.47,22.58 22.23,22.58 22.99,22.58 23.75,22.58 24.52,22.58 25.28,22.58 21.47,21.82 22.23,21.82 22.99,21.82 23.75,21.82 24.52,21.82 25.28,21.82 21.47,21.06 22.23,21.06 22.99,21.06 23.75,21.06 24.52,21.06 25.28,21.06 28.83,24.87 29.6,24.87 30.36,24.87 31.12,24.87 31.88,24.87 32.64,24.87 33.41,24.87 28.83,24.11 29.6,24.11 30.36,24.11 31.12,24.11 31.88,24.11 32.64,24.11 33.41,24.11 28.83,23.35 29.6,23.35 30.36,23.35 31.12,23.35 31.88,23.35 32.64,23.35 33.41,23.35 28.83,22.58 29.6,22.58 30.36,22.58 31.12,22.58 31.88,22.58 32.64,22.58 33.41,22.58 28.83,21.82 29.6,21.82 30.36,21.82 31.12,21.82 31.88,21.82 32.64,21.82 33.41,21.82 28.83,21.06 29.6,21.06 30.36,21.06 31.12,21.06 31.88,21.06 32.64,21.06 33.41,21.06 26.04,21.06 26.04,21.82 26.04,22.58 26.04,23.35 26.04,24.11 26.04,24.87 5.72,24.87 5.72,24.11 5.72,23.35 5.72,22.58 5.72,21.82 5.72,21.06 6.48,22.58 6.48,21.82 6.48,21.06 6.41,24.11 6.41,23.35 14.61,14.46 14.61,12.93 14.61,11.41 14.61,9.88 14.61,8.36 14.61,6.84 13.09,14.46 13.09,8.36 13.09,6.84 11.56,14.46 11.56,8.36 11.56,6.84 10.04,14.46 10.04,12.93 10.04,11.41 10.04,9.88 10.04,8.36 10.04,6.84 8.51,14.46 8.51,12.93 8.51,11.41 8.51,9.88 8.51,8.36 8.51,6.84 22.48,14.46 23.25,14.46 24.01,14.46 24.77,14.46 25.53,14.46 26.29,14.46 27.05,14.46 27.82,14.46 22.48,12.93 23.25,12.93 24.01,12.93 24.77,12.93 27.82,12.93 22.48,11.41 23.25,11.41 24.01,11.41 22.48,9.88 23.25,9.88 24.01,9.88 24.77,9.88 27.82,9.88 22.48,8.36 23.25,8.36 24.01,8.36 24.77,8.36 25.53,8.36 26.29,8.36 27.05,8.36 27.82,8.36 22.48,6.84 23.25,6.84 24.01,6.84 24.77,6.84 25.53,6.84 26.29,6.84 27.05,6.84 27.82,6.84 35.69,12.93 35.69,11.41 35.69,9.88 35.69,8.36 35.69,6.84 37.09,14.46 37.09,12.93 37.09,11.41 37.09,9.88 37.09,8.36 37.09,6.84 9.28,14.46 9.28,12.93 9.28,11.41 9.28,9.88 9.28,8.36 9.28,6.84 7.75,14.46 7.75,12.93 7.75,11.41 7.75,9.88 7.75,8.36 7.75,6.84 6.23,14.46 6.23,12.93 6.23,11.41 6.23,9.88 6.23,8.36 6.23,6.84
  pour Top (no thermals): 5.85,14.96 6.1,15.22 14.74,15.22 14.99,14.96 14.99,4.3 14.74,4.04 8.64,4.04 6.61,6.07 6.1,6.07 5.85,6.33
  pour Top (no thermals): 22.1,14.96 22.36,15.22 28.45,15.22 28.71,14.96 28.71,4.3 28.45,4.04 22.36,4.04 22.1,4.3
  pour Top (no thermals): 20.96,27.03 20.96,20.93 21.21,20.68 26.17,20.68 26.55,21.06 26.55,27.03 26.29,27.28 21.21,27.28
  pour Top (no thermals): 28.33,27.03 28.33,20.93 28.58,20.68 33.66,20.68 33.91,20.93 33.91,27.03 33.66,27.28 28.58,27.28
  pour Bottom (no thermals): 37.22,15.22 37.47,14.96 37.47,6.71 35.56,4.8 35.31,5.06 35.31,13.69 36.83,15.22
  pour Bottom (no thermals): -1.01,25.38 6.86,25.38 7.24,25 7.24,18.9 8.64,17.5 8.64,16.11 9.53,15.22 14.74,15.22 14.99,14.96 14.99,4.3 14.74,4.04 8.64,4.04 6.61,6.07 6.1,6.07 5.85,6.33 5.85,15.09 5.46,15.47 -1.01,15.47
  pour Bottom (no thermals): 21.34,25.38 20.96,25 20.96,19.03 21.34,18.65 22.61,18.65 23.63,17.63 23.63,16.11 22.74,15.22 22.36,15.22 22.1,14.96 22.1,4.3 22.36,4.04 28.45,4.04 28.71,4.3 28.71,14.96 29.21,15.47 31.63,15.47 31.88,15.73 31.88,17.63 34.17,19.92 34.17,25.12 33.91,25.38
  pour Top (no thermals): 35.31,14.96 35.56,15.22 37.22,15.22 37.47,14.96 37.47,6.71 35.56,4.8 35.31,5.06
  pour Route2 (no thermals): -1.01,27.28 40.01,27.28 40.26,27.03 40.26,19.03 37.47,16.23 37.47,6.71 34.8,4.04 8.64,4.04 6.61,6.07 -1.01,6.07
  pour Route62 (no thermals): -1.01,27.28 40.01,27.28 40.26,27.03 40.26,19.03 37.47,16.23 37.47,6.71 34.8,4.04 8.64,4.04 6.61,6.07 -1.01,6.07
  pour Top (no thermals): -1.01,37.19 2.67,37.19 5.46,39.98 6.35,39.98 6.74,40.36 6.99,40.36 8.01,39.35 8.77,39.35 10.67,37.44 11.43,37.44 11.94,36.94 11.94,36.81 11.43,36.3 10.16,36.3 8.77,37.7 5.85,37.7 5.46,37.32 5.46,34.9 5.97,34.39 7.12,34.39 7.24,34.27 7.24,33.76 7.37,33.63 8.01,33.63 8.64,33 10.67,33 10.04,32.36 8.39,32.36 6.74,30.71 6.74,28.17 6.48,27.92 6.48,25.63 6.99,25.12 6.99,20.93 6.74,20.68 -1.01,20.68 -1.01,25.38 3.94,25.38 4.32,25.76 4.32,32.74 2.16,34.9 -1.01,34.9
C_A
  Top 0.254: R11.2 C34.1 27.33,36.7 27.56,36.94 28.71,36.94 29.24,36.41 U1.25
C_B
  Top 0.254: U1.26 29.99,35.64 29.85,35.5 29.25,35.5 29.11,35.35 C35.1 R12.2
C_C
  Top 0.254: R13.2 30.99,33.63 | 30.99,33.63 C36.1 | U1.28 30.99,33.63
CAL
  Top 0.254: U1.12 29.23,44.65 26.61,44.65 25.79,43.82 24.25,43.82 23.64,43.21 21.54,43.21 19.96,41.63 18.61,41.63 18.54,41.56 U2.34
CANH  (via drill 0.35)
  Top 0.305: U4.7 40.7,34.09 41.21,33.58 41.25,33.58 42.17,32.66 42.17,31.85 R17.1 42.22,31.86 v42.68,31.86
  Route62 0.305: J6.2 4.2,2.9 4.66,2.43 10.56,2.43 10.73,2.27 19.53,2.27 19.69,2.43 24,2.43 24.17,2.27 32.86,2.27 33.38,2.79 37.83,2.79 J5.2 42.23,7.19 42.23,12.07 42.47,12.31 42.47,20.79 42.23,21.03 42.23,21.6 42.47,21.84 42.47,26.25 42.23,26.49 42.23,27.06 42.53,27.36 42.53,31.71 v42.68,31.86
CANL  (via drill 0.35)
  Top 0.305: v4.96,3.15 v3.43,3.15 | U4.6 40.38,33.44 40.93,32.89 v40.97,32.89
  Route62 0.305: v3.43,3.15 2.54,3.15 2.2,3.5 J6.3 | v40.97,32.89 40.97,32.24 42.02,31.2 42.02,27.49 41.77,27.25 41.77,26.3 42.02,26.06 42.02,22.03 41.77,21.79 41.77,20.84 42.02,20.6 42.02,12.5 41.77,12.26 41.77,9.87 JP1.1 39.63,5.94 38.74,5.06 38.1,5.06 J5.3 37.76,4.27 36.74,3.25 33.2,3.25 32.67,2.72 24.36,2.72 24.19,2.89 19.5,2.89 19.34,2.72 10.92,2.72 10.49,3.15 v4.96,3.15
ENABLE
  Top 0.254: U1.11 29.99,44.26 29.76,44.03 29.09,44.03 28.87,44.24 26.89,44.24 26.06,43.42 24.42,43.42 23.81,42.81 21.71,42.81 20.13,41.23 18.91,41.23 U2.33
FAULT  (via drill 0.35)
  Top 0.254: U2.28 20.07,38.85 20.57,38.85 v20.63,38.92 | U1.17 27.35,41.41 26.72,40.78 23.53,40.78 v23.27,40.52
  Route62 0.254: v20.63,38.92 21.04,38.92 22.64,40.52 v23.27,40.52
GHA
  Top 0.203: Q1.4 7.24,20.42 7.24,27.41 7.62,27.79 7.62,30.45 8.71,31.53 10.1,31.53 10.67,32.11 12.62,32.11 U2.8
GHB
  Top 0.203: Q3.4 26.8,20.42 26.8,29.82 26.17,30.46 20.94,30.46 19.75,31.65 19.15,31.65 U2.17
GHC
  Top 0.203: Q5.4 34.17,20.42 34.17,30.08 33.79,30.46 26.69,30.46 26.34,30.81 21.1,30.81 19.91,32.01 19.5,32.01 U2.18
GLA
  Top 0.203: Q2.4 8.01,25.25 8.01,27.16 8.39,27.54 8.39,30.2 9.01,30.82 10.4,30.82 10.93,31.35 13.27,31.35 U2.10
GLB  (via drill 0.35)
  Top 0.203: Q4.4 14.23,24.87 14.1,25 14.1,30.08 14.86,30.84 v16.13,30.84 | U2.15 v17.66,31.73 | v17.66,31.73
  Route62 0.203: v17.66,31.73 16.77,30.84 v16.13,30.84
GLC
  Top 0.203: Q6.4 34.88,25.3 34.88,30.38 34.04,31.22 26.94,31.22 26.63,31.52 21.4,31.52 U2.20
GND  (via drill 0.35)
  Top 0.203: U2.12 13.93,30.59 11.18,30.59 10.93,30.33 R1.1 | U2.13 17.39,30.59 17.91,30.59 18.29,30.2 R2.1 | U2.22 19.69,34.65 19.69,34.27 21.72,32.24 26.93,32.24 27.18,31.98 34.29,31.98 36.07,30.2 v36.07,29.82 | U2.2 11.33,35.06 9.44,35.06 R7.2 9.22,35.03 6.49,35.03 C30.1 | U2.43 12.45,39.06 12.45,39.1 v12.33,39.22 | NTCG164BH103HT1.1 v27.56,21.95
  Top 0.254: C26.2 17.62,41.35 U2.35 | U2.49 15.63,36.23 v15.63,37.19 | 20.61,38.07 20,38.07 U2.27 | C29.2 20.99,38.07 20.61,38.07 | v20.61,38.01 20.61,38.07 | U1.47 37.22,42.91 37.37,43.05 37.37,43.28 37.52,43.44 C14.2 | U4.2 36.48,34.09 36.47,34.09 36.35,34.09 C25.2 | U2.2 12.44,36.17 v12.58,36.17
  Top 0.305: 38.41,34.09 U4.9
  Route62 0.203: v27.56,21.95 27.56,22.71 26.93,23.35 26.93,24.61 28.07,25.75 28.07,32.62 v27.94,32.74
  other vias: 13.59,35.16 15.63,33.12 17.66,35.16 16.64,34.14 17.66,37.32 16.64,38.33 14.74,38.33 13.59,37.19 14.61,36.17 16.64,36.17 15.63,35.16 15.72,39.26 14.61,34.14 18.67,36.17 16.13,14.46 17.66,14.46 19.18,14.46 20.71,14.46 16.13,12.93 19.18,12.93 20.71,12.93 20.71,11.41 16.13,9.88 19.18,9.88 20.71,9.88 16.13,8.36 17.66,8.36 19.18,8.36 20.71,8.36 16.13,6.84 17.66,6.84 19.18,6.84 20.71,6.84 16.9,14.46 18.42,14.46 19.94,14.46 19.94,12.93 21.47,14.46 21.47,12.93 16.9,6.84 18.42,6.84 19.94,6.84 21.47,6.84 16.9,8.36 18.42,8.36 19.94,8.36 21.47,8.36 19.94,11.41 21.47,11.41 21.47,9.88 19.94,9.88 29.34,14.46 30.87,14.46 32.39,14.46 31.63,14.46 33.91,14.46 33.15,14.46 34.67,14.46 29.34,12.93 33.91,12.93 33.15,12.93 34.67,12.93 29.34,11.41 33.91,11.41 33.15,11.41 34.67,11.41 29.34,9.88 33.91,9.88 33.15,9.88 34.67,9.88 29.34,8.36 30.87,8.36 32.39,8.36 31.63,8.36 33.91,8.36 33.15,8.36 34.67,8.36 29.34,6.84 30.87,6.84 32.39,6.84 31.63,6.84 33.91,6.84 33.15,6.84 34.67,6.84 15.5,29.82 16.26,29.82 17.02,29.82 18.55,29.82 14.74,29.06 15.5,29.06 16.26,29.06 17.02,29.06 18.55,29.06 14.74,28.3 15.5,28.3 16.26,28.3 9.66,29.82 10.42,29.82 11.18,29.82 11.94,29.82 9.66,29.06 10.42,29.06 11.18,29.06 11.94,29.06 11.94,28.3 12.7,28.3 13.47,29.82 13.47,29.06 13.47,28.3 36.83,29.82 37.6,29.82 39.88,28.3 36.07,29.06 36.83,29.06 37.6,29.06 39.12,29.06 38.36,28.3 39.12,28.3 36.07,28.3 36.83,28.3 37.6,28.3 38.36,29.82 38.36,29.06 12.7,29.82 12.7,29.06 17.78,29.82 17.78,29.06 5.21,14.46 5.21,12.93 5.21,11.41 5.21,9.88 5.21,8.36 5.21,6.84 3.69,14.46 3.69,12.93 3.69,11.41 3.69,9.88 3.69,8.36 3.69,6.84 14.74,29.82 12.32,41.51 13.85,43.03 31.37,32.74 35.06,32.24 36.45,30.84 25.02,32.98 21.98,32.98 30.23,34.9 21.96,36.28 20.94,35.43 20.83,34.12 28.45,36.17 32.14,33.63 26.29,37.19 24.9,37.19 26.28,40.11 23.37,43.87 24.9,40.12 20.79,43.39 18.27,42.22 25.51,44.48 26.27,46.77 21.96,45.62 18.78,44.48 16.01,44.43 38.99,41.63 38.99,44.05 23.63,37.21 29.34,28.05 30.1,28.05 30.87,28.05 31.63,28.05 32.39,28.05 33.15,28.05 29.34,28.81 30.1,28.81 30.87,28.81 31.63,28.81 32.39,28.81 33.15,28.81 21.98,28.05 22.74,28.05 23.5,28.05 24.26,28.05 25.02,28.05 25.79,28.05 21.98,28.81 22.74,28.81 23.5,28.81 24.26,28.81 25.02,28.81 25.79,28.81 1.91,28.17 1.91,28.93 1.91,29.7 3.43,28.17 3.43,28.93 3.43,29.7 1.15,28.17 1.15,28.93 1.15,29.7 2.67,28.17 2.67,28.93 2.67,29.7 3.43,30.46 3.43,31.22 3.43,31.98 2.67,30.46 2.67,31.22 2.67,31.98 30.1,14.46 30.1,12.93 30.1,9.88 30.1,8.36 30.1,6.84 36.45,3.93 40.88,18.77 40.88,24.49 40.88,28.68 42.91,26.77 42.91,21.31 38.74,34.52 38.74,33 6.23,36.68 6.23,35.16 7.88,35.27 9.4,35.28 3.19,38.82 6.1,40.87 7.75,42.65 10.93,43.92 21.98,49.89 17.28,46.71 35.82,49.13 37.22,46.97 32.26,48.24 29.34,47.25 32.26,50.78 28.83,50.78 19.82,52.68 24.9,52.68 32.52,42.9 34.8,40.87 31.5,37.82 33.02,37.82 29.21,41.25 29.21,40.11 33.28,42.9 34.8,40.11 37.72,36.17 33.28,32.74 23.25,34.39 26.51,34.39 24.86,35.5 21.98,47.86 42.91,11.66 42.91,7.47 41.91,1.88 38.1,5.9 37.47,0.96 15.12,0.96 4.07,0.96 1.04,3.03 11.19,3.42 19.05,3.41 24.64,3.41 32.39,3.41 1.91,14.46 1.91,12.93 1.91,11.41 1.91,9.88 1.91,8.36 1.91,6.84 1.04,49 6.61,52.94 1.04,44.05 5.85,44.3 13.97,49.25 10.29,49.25 10.29,52.94 13.97,52.94 42.91,52.05 42.91,47.6 42.91,43.03 38.23,52.05 38.36,15.85 38.36,13.06
  pour Top (no thermals): 15.24,14.96 15.5,15.22 21.59,15.22 21.85,14.96 21.85,4.3 21.59,4.04 15.5,4.04 15.24,4.3
  pour Top (no thermals): 28.96,14.96 29.21,15.22 34.8,15.22 35.06,14.96 35.06,4.3 34.8,4.04 29.21,4.04 28.96,4.3
  pour Top (no thermals): 26.29,27.54 21.21,27.54 20.96,27.79 20.96,29.95 21.21,30.2 26.04,30.2 26.55,29.7 26.55,27.79
  pour Top (no thermals): 27.05,29.95 27.31,30.2 33.66,30.2 33.91,29.95 33.91,27.79 33.66,27.54 27.31,27.54 27.05,27.79
  pour Top (no thermals): 18.29,28.05 19.56,28.05 19.94,28.43 19.94,29.95 19.69,30.2 14.61,30.2 14.36,29.95 14.36,27.79 14.61,27.54 17.78,27.54
  pour Top (no thermals): 9.15,29.95 9.4,30.2 13.59,30.2 13.85,29.95 13.85,27.79 13.59,27.54 11.56,27.54 10.93,28.17 9.91,28.17 9.15,28.93
  pour Top (no thermals): 40.26,27.79 40.01,27.54 37.98,27.54 37.6,27.92 35.95,27.92 35.69,28.17 35.69,29.95 35.95,30.2 38.48,30.2 40.26,28.43
  pour Bottom (no thermals): -1.01,15.22 -1.01,6.07 5.34,6.07 5.59,6.33 5.59,14.96 5.34,15.22
  pour Top (no thermals): -1.01,15.22 -1.01,6.07 5.34,6.07 5.59,6.33 5.59,14.96 5.34,15.22
  pour Top (no thermals): 10.29,35.16 9.78,35.66 7.62,35.66 6.86,36.43 6.86,37.19 6.61,37.44 5.97,37.44 5.72,37.19 5.72,34.9 5.97,34.65 7.12,34.65 7.37,34.9 11.31,34.9 11.43,35.03 11.31,35.16
  pour Top (no thermals): 12.83,38.84 12.83,39.22 11.82,40.24 11.82,40.62 12.07,40.87 12.2,40.87 14.61,43.28 14.61,43.54 14.36,43.79 13.97,43.79 11.18,41 11.18,39.98 12.45,38.71 12.7,38.71
  pour Top (no thermals): -1.01,34.65 1.91,34.65 4.07,32.49 4.07,25.89 3.81,25.63 -1.01,25.63
  pour Top (no thermals): 26.67,45.19 26.67,44.68 25.79,43.79 24.26,43.79 23.63,43.16 21.59,43.16 20.07,41.63 18.67,41.63 17.91,40.87 17.66,40.87 17.28,41.25 17.28,41.89 17.53,42.14 17.53,42.78 17.66,42.9 19.31,42.9 20.45,44.05 22.61,44.05 23.75,45.19
  pour Bottom (no thermals): -1.01,34.65 1.91,34.65 6.35,30.2 11.56,30.2 11.82,30.46 11.82,36.3 15.5,39.98 15.88,39.98 19.44,36.43 19.44,30.46 19.69,30.2 38.48,30.2 40.26,28.43 40.26,19.03 35.06,13.82 35.06,4.3 34.8,4.04 29.21,4.04 28.96,4.3 28.96,14.96 29.21,15.22 34.8,15.22 38.87,19.28 38.87,27.16 38.48,27.54 16.51,27.54 16.01,27.03 16.01,19.03 19.82,15.22 21.59,15.22 21.85,14.96 21.85,4.3 21.59,4.04 15.5,4.04 15.24,4.3 15.24,15.09 14.86,15.47 12.2,15.47 11.94,15.73 11.94,27.16 11.56,27.54 4.45,27.54 4.07,27.16 4.07,25.89 3.81,25.63 -1.01,25.63
  pour Top (no thermals): -1.01,58.14 -1.01,37.44 2.54,37.44 5.34,40.24 6.35,40.24 8.39,42.27 10.16,42.27 12.83,44.94 13.34,44.94 13.97,44.3 13.97,43.79 11.18,41 11.18,39.98 13.15,38.01 15.37,40.24 16.01,40.24 19.69,36.55 19.69,34.78 21.85,32.62 27.05,32.62 27.31,32.36 34.42,32.36 36.33,30.46 38.61,30.46 40.52,28.55 40.52,18.9 37.72,16.11 37.72,6.58 34.93,3.79 8.51,3.79 6.48,5.82 -1.01,5.82 -1.01,-2.31 44.96,-2.31 44.96,58.14 12.96,58.14 12.96,47.09 8.89,43.03 8.64,43.03 6.86,44.81 6.86,45.06 9.78,47.98 9.78,58.14
  pour Route2 (no thermals): -1.01,34.65 1.91,34.65 6.35,30.2 11.56,30.2 11.82,30.46 11.82,36.3 15.5,39.98 15.88,39.98 19.44,36.43 19.44,30.46 19.69,30.2 38.48,30.2 40.26,28.43 40.26,27.79 40.01,27.54 -1.01,27.54
  pour Route62 (no thermals): -1.01,34.65 1.91,34.65 6.35,30.2 11.56,30.2 11.82,30.46 11.82,36.3 15.5,39.98 15.88,39.98 19.44,36.43 19.44,30.46 19.69,30.2 38.48,30.2 40.26,28.43 40.26,27.79 40.01,27.54 -1.01,27.54
  pour Route3 (no thermals): -1.01,34.65 1.91,34.65 6.35,30.2 11.56,30.2 11.82,30.46 11.82,36.3 15.5,39.98 15.88,39.98 19.44,36.43 19.44,30.46 19.69,30.2 38.48,30.2 40.26,28.43 40.26,19.03 37.47,16.23 37.47,6.71 34.8,4.04 8.64,4.04 6.61,6.07 -1.01,6.07
  pour Route63 (no thermals): -1.01,34.65 1.91,34.65 6.35,30.2 11.56,30.2 11.82,30.46 11.82,36.3 15.5,39.98 15.88,39.98 19.44,36.43 19.44,30.46 19.69,30.2 38.48,30.2 40.26,28.43 40.26,19.03 37.47,16.23 37.47,6.71 34.8,4.04 8.64,4.04 6.61,6.07 -1.01,6.07
  pour Route2 (no thermals): -1.01,34.9 2.16,34.9 6.61,30.46 11.43,30.46 11.56,30.59 11.56,36.43 15.37,40.24 16.01,40.24 19.69,36.55 19.69,30.71 19.94,30.46 38.61,30.46 40.52,28.55 40.52,18.9 37.72,16.11 37.72,6.58 34.93,3.79 8.51,3.79 6.48,5.82 -1.01,5.82 -1.01,-2.31 44.96,-2.31 44.96,58.14 -1.01,58.14
  pour Route3 (no thermals): -1.01,34.9 2.16,34.9 6.61,30.46 11.43,30.46 11.56,30.59 11.56,36.43 15.37,40.24 16.01,40.24 19.69,36.55 19.69,30.71 19.94,30.46 38.61,30.46 40.52,28.55 40.52,18.9 37.72,16.11 37.72,6.58 34.93,3.79 8.51,3.79 6.48,5.82 -1.01,5.82 -1.01,-2.31 44.96,-2.31 44.96,58.14 -1.01,58.14
  pour Route62 (no thermals): -1.01,34.9 2.16,34.9 6.61,30.46 11.43,30.46 11.56,30.59 11.56,36.43 15.37,40.24 16.01,40.24 19.69,36.55 19.69,30.71 19.94,30.46 38.61,30.46 40.52,28.55 40.52,18.9 37.72,16.11 37.72,6.58 34.93,3.79 8.51,3.79 6.48,5.82 -1.01,5.82 -1.01,-2.31 44.96,-2.31 44.96,58.14 -1.01,58.14
  pour Route63 (no thermals): -1.01,34.9 2.16,34.9 6.61,30.46 11.43,30.46 11.56,30.59 11.56,36.43 15.37,40.24 16.01,40.24 19.69,36.55 19.69,30.71 19.94,30.46 38.61,30.46 40.52,28.55 40.52,18.9 37.72,16.11 37.72,6.58 34.93,3.79 8.51,3.79 6.48,5.82 -1.01,5.82 -1.01,-2.31 44.96,-2.31 44.96,58.14 -1.01,58.14
  pour Bottom (no thermals): -1.01,34.9 2.16,34.9 6.61,30.46 11.43,30.46 11.56,30.59 11.56,36.43 15.37,40.24 16.01,40.24 19.69,36.55 19.69,30.71 19.94,30.46 38.61,30.46 40.52,28.55 40.52,18.9 37.72,16.11 37.72,6.58 34.93,3.79 8.51,3.79 6.48,5.82 -1.01,5.82 -1.01,-2.31 44.96,-2.31 44.96,58.14 -1.01,58.14
  pour Top (no thermals): 6.86,44.81 6.86,45.06 9.91,48.11 10.16,48.11 11.94,46.33 11.94,46.08 8.89,43.03 9.28,42.65 13.34,46.71 13.34,58.14 9.4,58.14 9.4,47.86 6.35,44.81 6.61,44.55
  pour Route63 (no thermals): 4.07,32.11 4.7,32.74 5.08,32.36 4.45,31.73
  pour Route62 (no thermals): 4.07,32.11 4.7,32.74 5.08,32.36 4.45,31.73
  pour Route2 (no thermals): 4.07,32.11 4.7,32.74 5.08,32.36 4.45,31.73
  pour Route3 (no thermals): 4.07,32.11 4.7,32.74 5.08,32.36 4.45,31.73
INHA
  Top 0.254: U1.10 30.49,45.55 30.26,45.78 29.22,45.78 28.58,45.14 23.64,45.14 22.55,44.05 20.51,44.05 19.4,42.93 16.73,42.93 15.55,41.75 15.55,40.96 U2.37
INHB
  Top 0.254: U1.9 30.99,45.62 30.43,46.19 29.05,46.19 28.41,45.55 23.47,45.55 22.38,44.45 20.35,44.45 19.23,43.34 16.51,43.34 15.41,42.24 14.72,42.24 14.1,41.63 14.1,40.23 U2.39
INHC
  Top 0.254: U1.8 31.49,45.7 30.59,46.59 28.89,46.59 28.24,45.95 23.25,45.95 22.23,44.94 20.2,44.94 19.05,43.79 16.39,43.79 15.24,42.65 14.48,42.65 12.79,40.96 12.79,40.27 13.42,39.64 13.42,39.51 U2.41
N$1
  Top 0.254: U1.5 32.99,45.55 33.22,45.78 35.39,45.78 35.84,46.23 C21.1 35.83,46.7 35.44,47.09 34.33,47.09 U5.1
N$2
  Top 0.203: U2.45 11.96,38.13 11.87,38.13 11.18,38.83 C11.1
  pour Top (no thermals): 12.2,37.7 11.94,37.95 11.69,37.95 11.43,37.7 10.67,37.7 8.77,39.6 8.01,39.6 7.12,40.49 7.12,40.74 8.39,42.02 10.16,42.02 12.83,44.68 13.21,44.68 13.72,44.17 13.72,43.79 10.93,41 10.04,41 9.91,40.87 9.91,39.86 10.04,39.73 10.55,39.73 12.39,37.89
N$3
  Top 0.254: C11.2 10.55,40.36 10.55,40.23 11.64,39.13 11.64,38.94 12.04,38.54 12.26,38.54 U2.44
N$4
  Top 0.203: U2.1 10.98,35.42 10.41,35.42 9.66,36.17 R7.1 9.35,36.74 9.02,37.06 R4.1
N$5
  Top 0.203: U2.5 11.62,33.23 8.85,33.23 8.7,33.38 8.7,34.08 8.5,34.28 C32.1
N$6
  Top 0.203: U2.3 11.68,34.7 10.4,34.7 10.25,34.56 10.25,34.1 10.12,33.97 C33.1
N$7
  Top 0.203: U2.4 11.65,33.97 C33.2
N$8
  Top 0.254: U1.6 32.49,45.62 33.05,46.19 33.28,46.19 33.41,46.31 33.41,48.75 U5.3 32.42,49.74 C22.2
N$9
  Top 0.254: R6.2 D1.1
N$10
  Top 0.254: U1.7 31.99,46.22 30.48,47.73 30.48,49.51 30.25,49.74 C23.1 29.83,49.76 R9.1
N$11
  Top 0.254: U1.45 37.23,41.91 37.37,42.04 37.37,42.4 37.54,42.57 R10.2
N$12  (via drill 0.35)
  Top 0.203: R15.1 NTCG164BH103HT1.2
  Top 0.254: R16.2 v34.55,33.72
  Route62 0.203: v34.55,33.72 34.55,33.76 33.79,34.52 30.87,34.52 28.43,32.08 28.43,25.61 27.56,24.74 R15.1
  other vias: 27.56,23.89
N$13  (via drill 0.35)
  Top 0.305: R17.2 40.95,31.23 40.6,31.23 v40.56,31.27
  Route62 0.305: v40.56,31.27 40.56,30.8 41.56,29.8 41.56,27.68 41.31,27.44 41.31,26.11 41.56,25.87 41.56,22.22 41.31,21.98 41.31,20.65 41.56,20.41 41.56,12.69 41.31,12.45 41.31,11.95 JP1.2
N$14
  Top 0.254: R18.2 39.25,31.88 40.14,32.77 U4.5
N$15
  Top 0.254: R19.2 39.25,35.54 39.37,35.41 39.88,35.41 40.14,35.15 U4.8
N$16  (via drill 0.35)
  Top 0.203: D1.2 30.23,1.38 v30.36,1.5 | U1.39 38.1,38.91 v38.28,38.72
  Route2 0.203: v30.36,1.5 31.63,2.77 39.5,2.77 40.66,3.93 40.66,5.59 42.17,7.09 42.17,30.76 39.88,33.04 39.88,35.97 38.28,37.57 v38.28,38.72
RX
  Top 0.254: U1.33 33.49,35.58 34,35.07 34.99,35.07 35.22,34.83 35.22,33.26 35.77,32.72 36.63,32.72 36.7,32.78 U4.4
SHA  (via drill 0.35)
  Top 0.203: v8.01,22.71 8.01,23.98 7.62,24.36 7.62,27.28 8.01,27.66 8.01,30.33 8.86,31.18 10.25,31.18 10.8,31.73 12.95,31.73 U2.9
  other vias: 9.53,22.71 11.05,22.71 9.53,21.19 11.05,21.19 8.01,21.19 9.53,19.66 11.05,19.66 8.01,19.66
  pour Top (no thermals): -1.01,20.43 5.21,20.43 5.46,20.17 5.46,18.77 5.72,18.52 6.48,18.52 7.5,19.54 7.5,23.22 7.75,23.47 13.59,23.47 13.85,23.22 13.85,15.73 13.59,15.47 -1.01,15.47
  pour Bottom (no thermals): 7.75,23.47 7.5,23.22 7.5,19.03 8.89,17.63 8.89,16.23 9.66,15.47 11.43,15.47 11.69,15.73 11.69,23.22 11.43,23.47
SHB  (via drill 0.35)
  Top 0.203: Q4.5 19.31,22.08 20.71,23.47 20.71,30.19 19.6,31.3 18.98,31.3 17.92,32.36 17.73,32.36 U2.16
  other vias: 16.9,22.71 18.42,22.71 19.94,22.71 16.9,21.19 18.42,21.19 19.94,21.19 16.9,19.66 18.42,19.66 19.94,19.66
  pour Top (no thermals): 14.1,23.22 14.36,23.47 20.45,23.47 20.71,23.22 20.71,20.81 21.09,20.43 24.77,20.43 25.02,20.17 25.02,18.77 25.28,18.52 27.05,18.52 27.31,18.27 27.31,15.73 27.05,15.47 14.36,15.47 14.1,15.73
  pour Bottom (no thermals): 16.51,23.47 16.26,23.22 16.26,19.16 19.94,15.47 22.61,15.47 23.37,16.23 23.37,17.5 22.48,18.39 21.21,18.39 20.71,18.9 20.71,23.22 20.45,23.47
SHC  (via drill 0.35)
  Top 0.203: Q6.5 35.6,22.08 34.52,23.15 34.52,30.22 33.91,30.84 26.82,30.84 26.49,31.17 21.25,31.17 20.05,32.36 19.85,32.36 U2.19
  other vias: 34.93,22.71 36.45,22.71 37.98,22.71 34.93,21.19 36.45,21.19 37.98,21.19 34.93,19.66 36.45,19.66 37.98,19.66
  pour Top (no thermals): 36.71,15.47 27.82,15.47 27.56,15.73 27.56,20.17 27.82,20.43 32.14,20.43 32.39,20.17 32.39,18.77 32.64,18.52 33.41,18.52 34.42,19.54 34.42,23.22 34.67,23.47 40.01,23.47 40.26,23.22 40.26,19.03
  pour Bottom (no thermals): 34.67,23.47 34.42,23.22 34.42,19.79 32.14,17.5 32.14,15.73 32.39,15.47 34.67,15.47 38.61,19.41 38.61,23.22 38.36,23.47
SOA
  Top 0.254: U2.25 20.28,36.94 22.23,36.94 22.99,36.17 R11.1
SOB
  Top 0.254: U2.24 20.48,36.17 21.13,36.17 22.25,35.05 24.38,35.05 24.59,34.85 25.13,34.85 25.34,35.05 26.78,35.05 26.93,34.9 R12.1
SOC
  Top 0.254: R13.1 22.32,33.63 21.18,34.77 20.27,34.77 U2.23
SPA  (via drill 0.35)
  Top 0.203: R1.2 10.93,27.54 10.67,27.79 9.78,27.79 8.79,28.78 8.79,30.1 9.15,30.46 9.28,30.46 10.55,30.46 11.05,30.97 13.6,30.97 U2.11
  other vias: 11.05,24.87 9.53,24.87 11.05,26.39 9.53,26.39 11.05,25.63 9.53,25.63
  pour Top (no thermals): 9.28,23.73 9.02,23.98 9.02,25.38 8.77,25.63 8.51,25.63 8.26,25.89 8.26,27.03 8.51,27.28 13.59,27.28 13.85,27.03 13.85,23.98 13.59,23.73
  pour Bottom (no thermals): 7.75,23.73 7.5,23.98 7.5,25.12 6.99,25.63 4.58,25.63 4.32,25.89 4.32,27.03 4.58,27.28 11.43,27.28 11.69,27.03 11.69,23.98 11.43,23.73
SPB  (via drill 0.35)
  Top 0.203: R2.2 18.29,27.54 18.55,27.79 19.79,27.79 20.3,28.3 20.3,30.1 19.46,30.94 17.55,30.94 17.03,31.47 17.03,31.65 U2.14
  other vias: 16.9,24.87 18.42,24.87 19.94,24.87 16.91,26.39 18.42,26.39 19.94,26.39
  pour Top (no thermals): 16.39,25.38 16.39,23.98 16.64,23.73 20.2,23.73 20.45,23.98 20.45,27.03 20.2,27.28 14.61,27.28 14.36,27.03 14.36,25.89 14.61,25.63 16.13,25.63
  pour Bottom (no thermals): 16.26,23.98 16.51,23.73 20.45,23.73 20.71,23.98 20.71,25.12 21.21,25.63 27.05,25.63 27.31,25.89 27.31,27.03 27.05,27.28 16.64,27.28 16.26,26.9
SPC  (via drill 0.35)
  Top 0.203: R3.2 37.85,27.28 37.47,27.66 35.69,27.66 35.31,28.05 35.31,30.46 34.14,31.63 27.04,31.63 26.78,31.88 21.57,31.88 19.33,34.12 19.33,34.29 U2.21
  other vias: 36.45,24.87 37.98,24.87 36.45,26.39 37.98,26.39
  pour Top (no thermals): 36.2,23.73 35.95,23.98 35.95,25.38 35.69,25.63 35.44,25.63 35.18,25.89 35.18,27.03 35.44,27.28 40.01,27.28 40.26,27.03 40.26,23.98 40.01,23.73
  pour Bottom (no thermals): 38.36,23.73 38.61,23.98 38.61,27.03 38.36,27.28 27.82,27.28 27.56,27.03 27.56,25.89 27.82,25.63 34.04,25.63 34.42,25.25 34.42,23.98 34.67,23.73
SPI1_CS
  Top 0.254: U1.16 28.63,41.91 28.87,42.14 28.87,43.67 28.7,43.84 27.05,43.84 26.23,43.01 24.59,43.01 23.98,42.4 21.88,42.4 20.3,40.82 19.21,40.82 U2.32
SPI1_MISO
  Top 0.254: U1.14 27.27,42.9 26.54,42.18 26.26,42.18 25.77,41.69 25.77,41.67 25.28,41.18 22.58,41.18 R5.1 20.98,39.58 20.09,39.58 U2.29
SPI1_MOSI  (via drill 0.35)
  Top 0.254: U2.30 19.79,39.98 20.61,39.98 22.22,41.59 24.74,41.59 v25.1,41.95 v25.11,41.95 | v26.53,41.52 26.6,41.59 26.6,41.66 27.28,42.34 27.92,42.34 U1.15
  Route62 0.254: v25.11,41.95 26.1,41.95 v26.53,41.52
SPI1_SCK
  Top 0.254: U2.31 19.51,40.41 20.47,40.41 22.05,41.99 24.22,41.99 24.83,42.61 26.4,42.61 27.2,43.41 U1.13
SPI3_CS  (via drill 0.35)
  Top 0.305: U1.43 39.23,40.91 39.68,41.35 39.68,46.73 v38.84,47.57 | v39.63,50.27 39.04,50.27 36.48,52.83 27.33,52.83 26.04,51.54 22.1,51.54 21.47,50.91 U3.1
  Route62 0.305: v39.63,50.27 39.88,50.02 39.88,49.63 38.61,48.37 38.61,47.86 38.84,47.63 v38.84,47.57
SPI3_MISO
  Top 0.305: U1.41 39.54,39.91 40.64,41.01 40.64,47.38 36.1,51.92 27.94,51.92 26.55,50.52 26.55,48.75 26.17,48.37 U3.6
SPI3_MOSI
  Top 0.305: U1.42 39.38,40.41 40.13,41.16 40.13,47.24 35.91,51.46 28.25,51.46 27.05,50.27 27.05,48.24 26.55,47.73 25.08,47.73 U3.5
SPI3_SCK
  Top 0.305: U1.40 39.69,39.41 41.15,40.87 41.15,47.52 36.29,52.38 27.64,52.38 26.04,50.78 26.04,50.02 25.66,49.63 U3.7
SWCLK  (via drill 0.35)
  Top 0.203: v37.6,37.19 37.6,38.2 37.4,38.41 U1.38
  Bottom 0.203: U$8.P$1 42.17,20.66 41.92,20.91 41.92,30.8 40.82,31.9 40.56,31.9 39.5,32.96 39.5,35.29 37.98,36.8 v37.6,37.19
SWDIO  (via drill 0.35)
  Top 0.203: v36.58,37.19 36.49,37.28 U1.37
  Bottom 0.203: v36.58,37.19 36.58,37.32 37.22,37.95 37.73,37.95 39.88,35.8 39.88,33.09 40.71,32.26 40.97,32.26 42.42,30.81 42.42,27.18 42.28,27.04 42.28,21.05 42.52,20.81 42.52,17.68 43.18,17.02 43.18,15.95 42.2,14.96 U$4.P$1
TMP_SENSE
  Top 0.254: U1.29 31.49,35.04 32.03,34.5 C9.1 33.3,34.52 R16.1
TX
  Top 0.254: U4.1 36.7,34.73 35.91,35.53 34.22,35.53 33.99,35.76 U1.34
VDD  (via drill 0.35)
  Top 0.254: U2.36 16.79,41.23 16.92,41.36 16.92,42.22 C26.1 16.24,41.53 v16.24,41.5 | U2.40 13.5,40.13 13.5,40.48 v13.45,40.54 | v12.13,40.41 12.13,40.35 13.01,39.47 13.01,39.2 U2.42 | U2.38 14.51,40.53 14.51,41.11 v14.89,41.49
  Route62 0.254: v12.13,40.41 12.27,40.54 v13.45,40.54 13.45,40.6 13.85,41 14.4,41 v14.89,41.49 14.91,41.5 v16.24,41.5
(copper drawn outside any net)
  shapes: Route62 area x1

### Text on the board
SilkscreenTop: KRC FOC Driver v1 | A | B | C
SilkscreenBottom: KRC FOC Driver v1 | A | B | C | GND | GDC | 3.3V | GND | 6S